# Altium project YOBA_Hamon_lite.PrjPcb
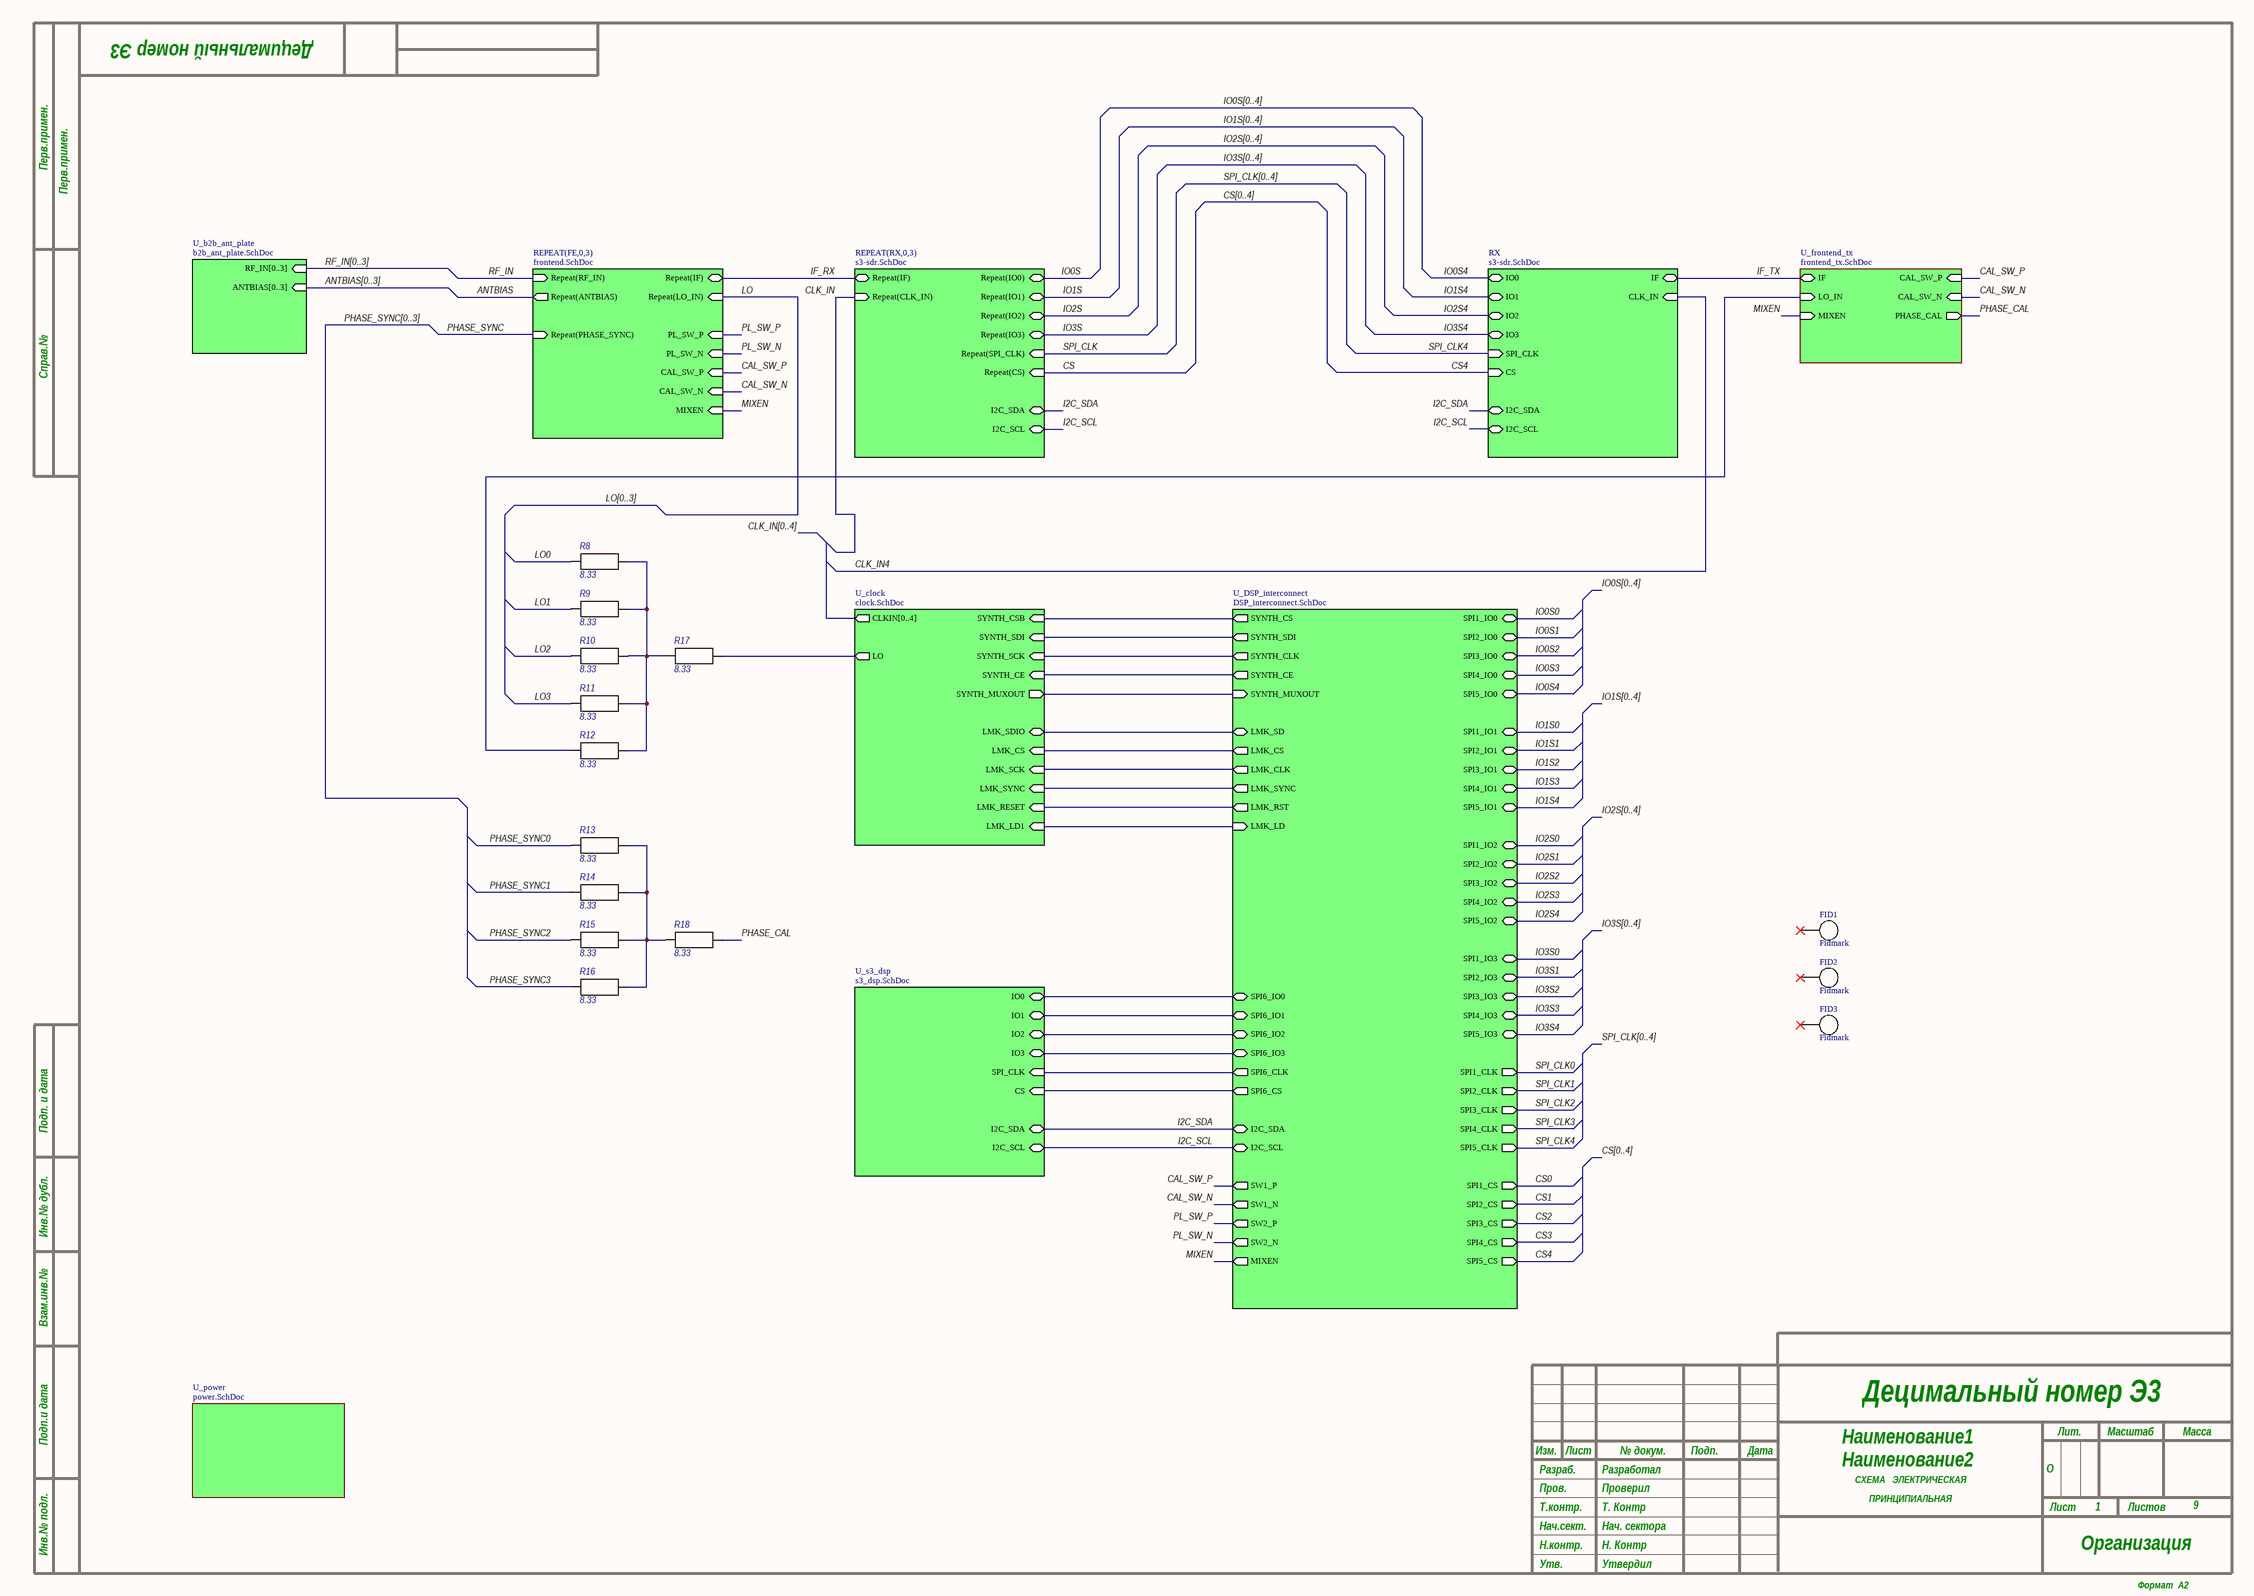
[diagram p0: main.SchDoc]
9 sheets, 333 parts. Net scope: hierarchical (ports join the sheet entries above them; power ports are global).
Board file: HamonLite_pcb.PcbDoc
Sheets:
  main.SchDoc
    FE0 = frontend.SchDoc
    FE1 = frontend.SchDoc
    FE2 = frontend.SchDoc
    FE3 = frontend.SchDoc
    RX0 = s3-sdr.SchDoc
    RX1 = s3-sdr.SchDoc
    RX2 = s3-sdr.SchDoc
    RX3 = s3-sdr.SchDoc
    U_b2b_ant_plate = b2b_ant_plate.SchDoc
    U_clock = clock.SchDoc
    RX = s3-sdr.SchDoc
    U_frontend_tx = frontend_tx.SchDoc
    U_power = power.SchDoc
    U_DSP_interconnect = DSP_interconnect.SchDoc
    U_s3_dsp = s3_dsp.SchDoc

## Sheet main.SchDoc: Наименование
size 594 x 420 mm; ApprovedBy: Утвердил; CheckedBy: Проверил; Author: Разработал; CompanyName: Организация; SheetNumber: 1; SheetTotal: 9; PageSetup: Record=PageOptions|CenterHorizontal=True|CenterVertical=True|PrintScale=0.94|XCorrection=1.00|YCorrection=1.00|PrintKind=1|BorderSize=5000000|LeftOffset=0|BottomOffset=0|Orientation=1|PaperLength=1000|PaperWidth=1000|Scale=100|PaperSource=7|PrintQuality=-4|MediaType=1|DitherType=10|PaperKind=A4|PrintScaleMode=1; DecimalNumber: Децимальный номер; HeadOfSector: Нач. сектора; MainDevice: Перв.примен.; Name1: Наименование1; lit_A: О; n_kontr: Н. Контр; t_kontr: Т. Контр; Name2: Наименование2; DocumentName: Sheet1.SCHDOC

### Parts
FID1  Fidmark  [FidMark]  (no BOM)
FID2  Fidmark  [FidMark]  (no BOM)
FID3  Fidmark  [FidMark]  (no BOM)
R8  8.33  [C0402R]
R9  8.33  [C0402R]
R10  8.33  [C0402R]
R11  8.33  [C0402R]
R12  8.33  [C0402R]
R13  8.33  [C0402R]
R14  8.33  [C0402R]
R15  8.33  [C0402R]
R16  8.33  [C0402R]
R17  8.33  [C0402R]
R18  8.33  [C0402R]

### Sub-sheets
REPEAT(FE,0,3) = frontend.SchDoc: Repeat(IF) (bidir), Repeat(LO_IN) (in), Repeat(RF_IN) (in), Repeat(PHASE_SYNC) (in), Repeat(ANTBIAS) (out), PL_SW_P (in), PL_SW_N (in), CAL_SW_P (in), CAL_SW_N (in), MIXEN (in)
REPEAT(RX,0,3) = s3-sdr.SchDoc: Repeat(IF) (bidir), Repeat(CLK_IN) (in), Repeat(IO0) (bidir), Repeat(IO1) (bidir), Repeat(IO2) (bidir), Repeat(IO3) (bidir), Repeat(SPI_CLK) (in), Repeat(CS) (in), I2C_SDA (bidir), I2C_SCL (bidir)
RX = s3-sdr.SchDoc: IF (bidir), CLK_IN (in), IO0 (bidir), IO1 (bidir), IO2 (bidir), IO3 (bidir), SPI_CLK (in), CS (in), I2C_SDA (bidir), I2C_SCL (bidir)
U_b2b_ant_plate = b2b_ant_plate.SchDoc: RF_IN[0..3] (in), ANTBIAS[0..3] (in)
U_clock = clock.SchDoc: SYNTH_CSB (in), SYNTH_SDI (in), SYNTH_SCK (in), SYNTH_CE (in), SYNTH_MUXOUT (out), LO (out), CLKIN[0..4] (out), LMK_SCK (in), LMK_SDIO (bidir), LMK_CS (in), LMK_SYNC (in), LMK_RESET (in), LMK_LD1 (in)
U_DSP_interconnect = DSP_interconnect.SchDoc: SPI1_CLK (out), SPI1_CS (out), SPI1_IO0 (bidir), SPI1_IO1 (bidir), SPI1_IO2 (bidir), SPI1_IO3 (bidir), SPI2_IO3 (bidir), SPI2_CS (out), SPI2_IO0 (bidir), SPI2_CLK (out), SPI2_IO1 (bidir), SPI2_IO2 (bidir), SPI3_IO3 (bidir), SPI3_CS (out), SPI3_IO0 (bidir), SPI3_IO1 (bidir), SPI3_IO2 (bidir), SPI3_CLK (out), SPI4_IO0 (bidir), SPI4_IO1 (bidir), SPI4_IO2 (bidir), SPI4_IO3 (bidir), SPI4_CS (out), SPI4_CLK (out), SPI5_IO0 (bidir), SPI5_IO3 (bidir), SPI5_CS (out), SPI5_CLK (out), SPI5_IO1 (bidir), SPI5_IO2 (bidir), SYNTH_CS (out), SYNTH_CLK (out), SYNTH_MUXOUT (in), SYNTH_SDI (out), SYNTH_CE (out), LMK_CLK (out), LMK_CS (out), LMK_SD (bidir), LMK_RST (out), LMK_SYNC (out), LMK_LD (in), I2C_SDA (bidir), I2C_SCL (bidir), SW1_N (out), SW1_P (out), SW2_P (out), SW2_N (out), MIXEN (out), SPI6_IO3 (bidir), SPI6_CS (out), SPI6_IO0 (bidir), SPI6_CLK (out), SPI6_IO1 (bidir), SPI6_IO2 (bidir)
U_frontend_tx = frontend_tx.SchDoc: LO_IN (in), IF (bidir), MIXEN (in), CAL_SW_N (in), CAL_SW_P (in), PHASE_CAL (out)
U_power = power.SchDoc: no entries
U_s3_dsp = s3_dsp.SchDoc: IO0 (bidir), IO1 (bidir), IO2 (bidir), IO3 (bidir), SPI_CLK (in), CS (in), I2C_SDA (bidir), I2C_SCL (bidir)

### Nets
ANTBIAS: sheet REPEAT(FE,0,3)/Repeat(ANTBIAS)
CAL_SW_N: sheet REPEAT(FE,0,3)/CAL_SW_N, sheet U_frontend_tx/CAL_SW_N, sheet U_DSP_interconnect/SW1_N
CAL_SW_P: sheet REPEAT(FE,0,3)/CAL_SW_P, sheet U_frontend_tx/CAL_SW_P, sheet U_DSP_interconnect/SW1_P
CLK: sheet U_DSP_interconnect/SPI6_CLK, sheet U_s3_dsp/SPI_CLK
CLK_IN: sheet REPEAT(RX,0,3)/Repeat(CLK_IN)
CS: sheet U_DSP_interconnect/SPI6_CS, sheet U_s3_dsp/CS
CS: sheet REPEAT(RX,0,3)/Repeat(CS)  [a separate net that carries the same name]
CS4: sheet RX/CS, sheet U_DSP_interconnect/SPI5_CS  [project net CS0]
I2C_SCL: sheet REPEAT(RX,0,3)/I2C_SCL, sheet RX/I2C_SCL, sheet U_DSP_interconnect/I2C_SCL, sheet U_s3_dsp/I2C_SCL
I2C_SDA: sheet REPEAT(RX,0,3)/I2C_SDA, sheet RX/I2C_SDA, sheet U_DSP_interconnect/I2C_SDA, sheet U_s3_dsp/I2C_SDA
IF_RX: sheet REPEAT(FE,0,3)/Repeat(IF), sheet REPEAT(RX,0,3)/Repeat(IF)
IF_TX: sheet RX/IF, sheet U_frontend_tx/IF  [project net IF]
IO0: sheet U_DSP_interconnect/SPI6_IO0, sheet U_s3_dsp/IO0
IO0S: sheet REPEAT(RX,0,3)/Repeat(IO0)
IO0S4: sheet RX/IO0, sheet U_DSP_interconnect/SPI5_IO0  [project net IO0]
IO1: sheet U_DSP_interconnect/SPI6_IO1, sheet U_s3_dsp/IO1
IO1S: sheet REPEAT(RX,0,3)/Repeat(IO1)
IO1S4: sheet RX/IO1, sheet U_DSP_interconnect/SPI5_IO1  [project net IO1]
IO2: sheet U_DSP_interconnect/SPI6_IO2, sheet U_s3_dsp/IO2
IO2S: sheet REPEAT(RX,0,3)/Repeat(IO2)
IO2S4: sheet RX/IO2, sheet U_DSP_interconnect/SPI5_IO2  [project net IO2]
IO3: sheet U_DSP_interconnect/SPI6_IO3, sheet U_s3_dsp/IO3
IO3S: sheet REPEAT(RX,0,3)/Repeat(IO3)
IO3S4: sheet RX/IO3, sheet U_DSP_interconnect/SPI5_IO3  [project net IO3]
LMK_CLK: sheet U_clock/LMK_SCK, sheet U_DSP_interconnect/LMK_CLK
LMK_CS: sheet U_clock/LMK_CS, sheet U_DSP_interconnect/LMK_CS
LMK_LD: sheet U_clock/LMK_LD1, sheet U_DSP_interconnect/LMK_LD
LMK_RESET: sheet U_clock/LMK_RESET, sheet U_DSP_interconnect/LMK_RST
LMK_SD: sheet U_clock/LMK_SDIO, sheet U_DSP_interconnect/LMK_SD
LMK_SYNC: sheet U_clock/LMK_SYNC, sheet U_DSP_interconnect/LMK_SYNC
LO: sheet REPEAT(FE,0,3)/Repeat(LO_IN)
LO0: R8.2
LO1: R9.2
LO2: R10.2
LO3: R11.2
MIXEN: sheet REPEAT(FE,0,3)/MIXEN, sheet U_frontend_tx/MIXEN, sheet U_DSP_interconnect/MIXEN
PHASE_CAL: R18.1 ; sheet U_frontend_tx/PHASE_CAL
PHASE_SYNC: sheet REPEAT(FE,0,3)/Repeat(PHASE_SYNC)
PHASE_SYNC0: R13.2
PHASE_SYNC1: R14.2
PHASE_SYNC2: R15.2
PHASE_SYNC3: R16.2
PL_SW_N: sheet REPEAT(FE,0,3)/PL_SW_N, sheet U_DSP_interconnect/SW2_N
PL_SW_P: sheet REPEAT(FE,0,3)/PL_SW_P, sheet U_DSP_interconnect/SW2_P
RF_IN: sheet REPEAT(FE,0,3)/Repeat(RF_IN)
SPI_CLK: sheet REPEAT(RX,0,3)/Repeat(SPI_CLK)
SPI_CLK4: sheet RX/SPI_CLK, sheet U_DSP_interconnect/SPI5_CLK  [project net CLK]
SYNTH_CE: sheet U_clock/SYNTH_CE, sheet U_DSP_interconnect/SYNTH_CE
SYNTH_CLK: sheet U_clock/SYNTH_SCK, sheet U_DSP_interconnect/SYNTH_CLK
SYNTH_CS: sheet U_clock/SYNTH_CSB, sheet U_DSP_interconnect/SYNTH_CS
SYNTH_MOSI: sheet U_clock/SYNTH_SDI, sheet U_DSP_interconnect/SYNTH_SDI
SYNTH_MUXOUT: sheet U_clock/SYNTH_MUXOUT, sheet U_DSP_interconnect/SYNTH_MUXOUT
NetC66_2: R17.1 ; sheet U_clock/LO
NetC73_1: R12.2 ; sheet U_frontend_tx/LO_IN
NetR8_1: R8.1 R9.1 R10.1 R11.1 R12.1 R17.2
NetR13_1: R13.1 R14.1 R15.1 R16.1 R18.2

Not connected (* = marked no-connect by the designer): FID1 1*; FID2 1*; FID3 1*

### Buses and harness runs
bus ANTBIAS[0..3] = sheet U_b2b_ant_plate/ANTBIAS[0..3]
bus CLK_IN[0..4] = sheet U_clock/CLKIN[0..4]
bus CS[0..4]
bus IO0S[0..4]
bus IO1S[0..4]
bus IO2S[0..4]
bus IO3S[0..4]
bus LO[0..3]
bus PHASE_SYNC[0..3]
bus RF_IN[0..3] = sheet U_b2b_ant_plate/RF_IN[0..3]
bus SPI_CLK[0..4]

### Notes on the sheet
- Перв.примен.
- Справ.№
- Подп. и дата
- Инв.№ дубл.
- Взам.инв.№
- Подп.и дата
- Разраб.
- Изм.
- Лист
- № докум.
- Подп.
- Дата
- Лит.
- Масштаб
- Масса
- Т.контр.
- Пров.
- СХЕМА   ЭЛЕКТРИЧЕСКАЯ
- ПРИНЦИПИАЛЬНАЯ
- Листов
- Инв.№ подл.
- Утв.
- Н.контр.
- Нач.сект.
- Формат  A2

### Library data of the parts
R8-R18 = res: Value: 8.33

## Sheet frontend.SchDoc: Наименование
size 420 x 297 mm; ApprovedBy: Утвердил; CheckedBy: Проверил; Author: Разработал; CompanyName: ВлГУ; DrawnBy: Н.Контр; Engineer: Т.Контр; SheetNumber: 3; SheetTotal: 9; PageSetup: Record=PageOptions|CenterHorizontal=True|CenterVertical=True|PrintScale=0.94|XCorrection=1.00|YCorrection=1.00|PrintKind=1|BorderSize=5000000|LeftOffset=0|BottomOffset=0|Orientation=1|PaperLength=1000|PaperWidth=1000|Scale=100|PaperSource=7|PrintQuality=-4|MediaType=1|DitherType=10|PaperKind=A4|PrintScaleMode=1; DecimalNumber: Децимальный номер; HeadOfSector: Нач. сектора; MainDevice: Перв.примен.; Name: Наименование; DocumentName: Sheet1.SCHDOC
Used 4 times, as channels FE0, FE1, FE2, FE3. Parts and nets are listed once, with the designators drawn on the sheet.
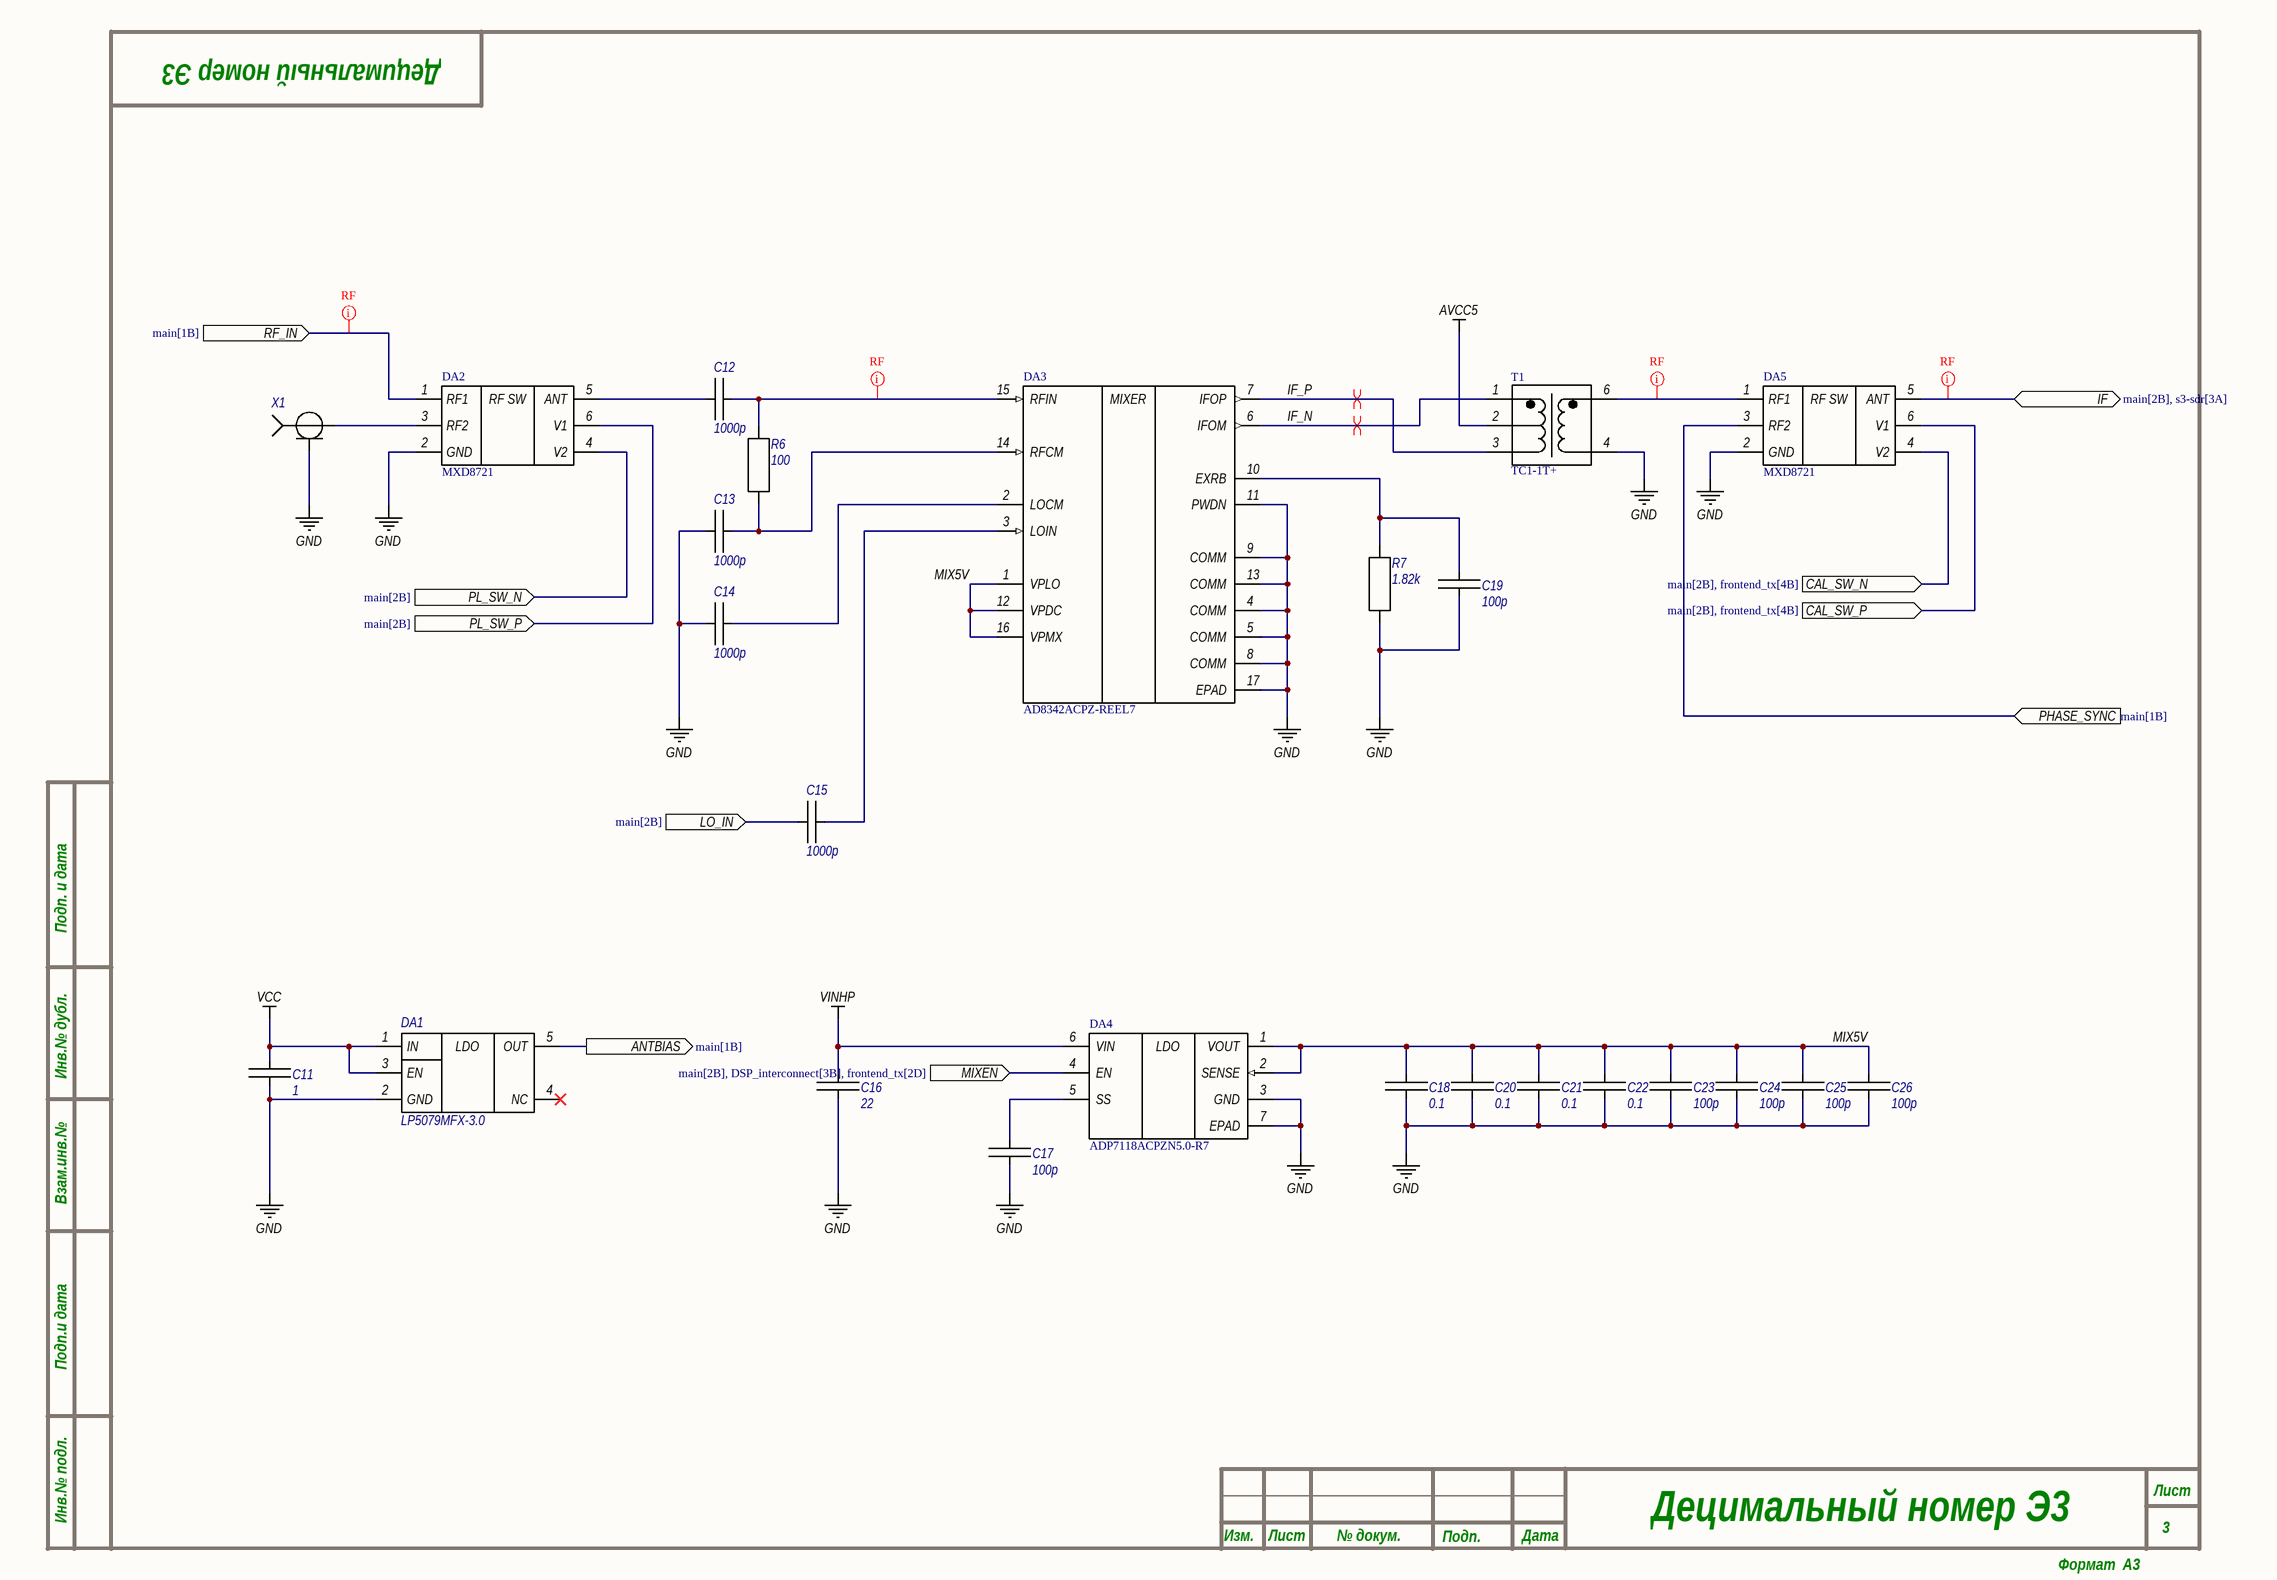
[diagram p1: frontend.SchDoc]

### Parts
C11  1  [C0805C]
C12  1000p  [C0402C]
C13  1000p  [C0402C]
C14  1000p  [C0402C]
C15  1000p  [C0402C]
C16  22  [C0805C]
C17  100p  [C0603C]
C18  0.1  [C0805C]
C19  100p  [C0603C]
C20  0.1  [C0805C]
C21  0.1  [C0805C]
C22  0.1  [C0805C]
C23  100p  [C0603C]
C24  100p  [C0603C]
C25  100p  [C0603C]
C26  100p  [C0603C]
DA1  LP5079MFX-3.0  [SOT23-5]
DA2  MXD8721  [SON35P100X50-6N]
DA3  AD8342ACPZ-REEL7  [CP_16_27_ADI-M]
DA4  ADP7118ACPZN5.0-R7  [CP-6-3_ADI]
DA5  MXD8721  [SON35P100X50-6N]
R6  100  [C0603R]
R7  1.82k  [C0603R]
T1  TC1-1T+  [AT224-1A_MNC]
X1  (no value)  [IPEX PAD]

### Ports
ANTBIAS (out, see main[1B]), CAL_SW_N (in, see main[2B], frontend_tx[4B]), CAL_SW_P (in, see main[2B], frontend_tx[4B]), IF (bidir, see main[2B], s3-sdr[3A]), LO_IN (in, see main[2B]), MIXEN (in, see main[2B], DSP_interconnect[3B], frontend_tx[2D]), PHASE_SYNC (in, see main[1B]), PL_SW_N (in, see main[2B]), PL_SW_P (in, see main[2B]), RF_IN (in, see main[1B])

### Nets
AVCC5: T1.2(SCONDARY_CT)
GND: C11.2 C13.1 C14.1 C16.2 C17.2 C18.2 C19.2 C20.2 C21.2 C22.2 C23.2 C24.2 C25.2 C26.2 DA1.2(GND) DA2.2(GND) DA3.4(COMM) DA3.5(COMM) DA3.8(COMM) DA3.9(COMM) DA3.11(PWDN) DA3.13(COMM) DA3.17(EPAD) DA4.3(GND) DA4.7(EPAD) DA5.2(GND) R7.2 T1.4(PRIMARY) X1.2
VCC: C11.1 DA1.1(IN) DA1.3(EN)
VINHP: C16.1 DA4.6(VIN)
ANTBIAS: DA1.5(OUT) ; port ANTBIAS
CAL_SW_N: DA5.4(V2) ; port CAL_SW_N
CAL_SW_P: DA5.6(V1) ; port CAL_SW_P
IF: DA5.5(ANT) ; port IF
IF_N: DA3.6(IFOM) T1.1(SECONDARY_DOT)  [project net IF_N_3]
IF_P: DA3.7(IFOP) T1.3(SECONDARY)  [project net IF_P_3]
LO_IN: C15.1 ; port LO_IN
MIX5V: C18.1 C20.1 C21.1 C22.1 C23.1 C24.1 C25.1 C26.1 DA3.1(VPLO) DA3.12(VPDC) DA3.16(VPMX) DA4.1(VOUT) DA4.2(SENSE)  [project net MIX5V_3]
MIXEN: DA4.4(EN) ; port MIXEN
PHASE_SYNC: DA5.3(RF2) ; port PHASE_SYNC
PL_SW_N: DA2.4(V2) ; port PL_SW_N
PL_SW_P: DA2.6(V1) ; port PL_SW_P
RF_IN: DA2.1(RF1) ; port RF_IN
NetC12_1: C12.1 DA2.5(ANT)
NetC12_2: C12.2 DA3.15(RFIN) R6.1
NetC13_2: C13.2 DA3.14(RFCM) R6.2
NetC14_2: C14.2 DA3.2(LOCM)
NetC15_2: C15.2 DA3.3(LOIN)
NetC17_1: C17.1 DA4.5(SS)
NetC19_1: C19.1 DA3.10(EXRB) R7.1
NetDA2_3: DA2.3(RF2) X1.1
NetDA5_1: DA5.1(RF1) T1.6(PRIMARY_DOT)

Not connected (* = marked no-connect by the designer): DA1 4(NC)*

### Channels
FE0: designators end in A; ports ANTBIAS=ANTBIAS0 CAL_SW_N=CAL_SW_N CAL_SW_P=CAL_SW_P IF=IF LO_IN=LO0 MIXEN=MIXEN PHASE_SYNC=PHASE_SYNC0 PL_SW_N=PL_SW_N PL_SW_P=PL_SW_P RF_IN=RF_IN0
FE1: designators end in B; ports ANTBIAS=ANTBIAS1 CAL_SW_N=CAL_SW_N CAL_SW_P=CAL_SW_P IF=IF LO_IN=LO1 MIXEN=MIXEN PHASE_SYNC=PHASE_SYNC1 PL_SW_N=PL_SW_N PL_SW_P=PL_SW_P RF_IN=RF_IN1
FE2: designators end in C; ports ANTBIAS=ANTBIAS2 CAL_SW_N=CAL_SW_N CAL_SW_P=CAL_SW_P IF=IF LO_IN=LO2 MIXEN=MIXEN PHASE_SYNC=PHASE_SYNC2 PL_SW_N=PL_SW_N PL_SW_P=PL_SW_P RF_IN=RF_IN2
FE3: designators end in D; ports ANTBIAS=ANTBIAS3 CAL_SW_N=CAL_SW_N CAL_SW_P=CAL_SW_P IF=IF LO_IN=LO3 MIXEN=MIXEN PHASE_SYNC=PHASE_SYNC3 PL_SW_N=PL_SW_N PL_SW_P=PL_SW_P RF_IN=RF_IN3

### Layout directives
net class RF: IF, NetC12A_2, NetDA5A_1, RF_IN0
differential pair: IF_N_FE0, IF_P_FE0

### Notes on the sheet
- Подп. и дата
- Инв.№ дубл.
- Взам.инв.№
- Подп.и дата
- Инв.№ подл.
- Изм.
- Лист
- № докум.
- Подп.
- Дата
- Формат  A3
- (in symbol AD8342ACPZ-REEL7) MIXER
- (in symbol ADP7118ACPZN5.0-R7) LDO
- (in symbol LP5907) LDO
- (in symbol MXD8721) RF SW

### Library data of the parts
C11-C26 = Cap
  C11: Value: 1
  C12-C15: Value: 1000p
  C16: Value: 22
  C17 C19 C23-C26: Value: 100p
  C18 C20-C22: Value: 0.1
DA1 = LP5907: Part number: LP5079MFX-3.0
DA2 DA5 = MXD8721: 0.5-6.0GHz SPDT Switch; Part number: MXD8721
DA3 = AD8342ACPZ-REEL7: Active Receive Mixer LF to 3 GHz; Manufacturer_Name: Analog Devices Inc; Copyright: Copyright (C) 2025 Ultra Librarian. All rights reserved.; Manufacturer_Part_Number: AD8342ACPZ-REEL7; RefDes: RefDes; Type: Type
DA4 = ADP7118ACPZN5.0-R7: 20 V, 200 mA, Low Noise, CMOS LDO Linear Regulator; Manufacturer_Name: Analog Devices Inc; Copyright: Copyright (C) 2026 Ultra Librarian. All rights reserved.; Manufacturer_Part_Number: ADP7118ACPZN5.0-R7; Datasheet: https://www.analog.com/media/en/technical-documentation/data-sheets/adp7118.pdf; RefDes: RefDes; Type: Type
R6 R7 = res
  R6: Value: 100
  R7: Value: 1.82k
T1 = TC1-1T+: Description; Manufacturer_Name: Mini Circuits; Type: Balun; Copyright: Copyright (C) 2026 Ultra Librarian. All rights reserved.; Manufacturer_Part_Number: TC1-1T+; RefDes: RefDes
X1 = Ipex

## Sheet s3-sdr.SchDoc
size 420 x 297 mm; SheetNumber: 2; SheetTotal: 9
Used 5 times, as channels RX0, RX1, RX2, RX3, RX. Parts and nets are listed once, with the designators drawn on the sheet.
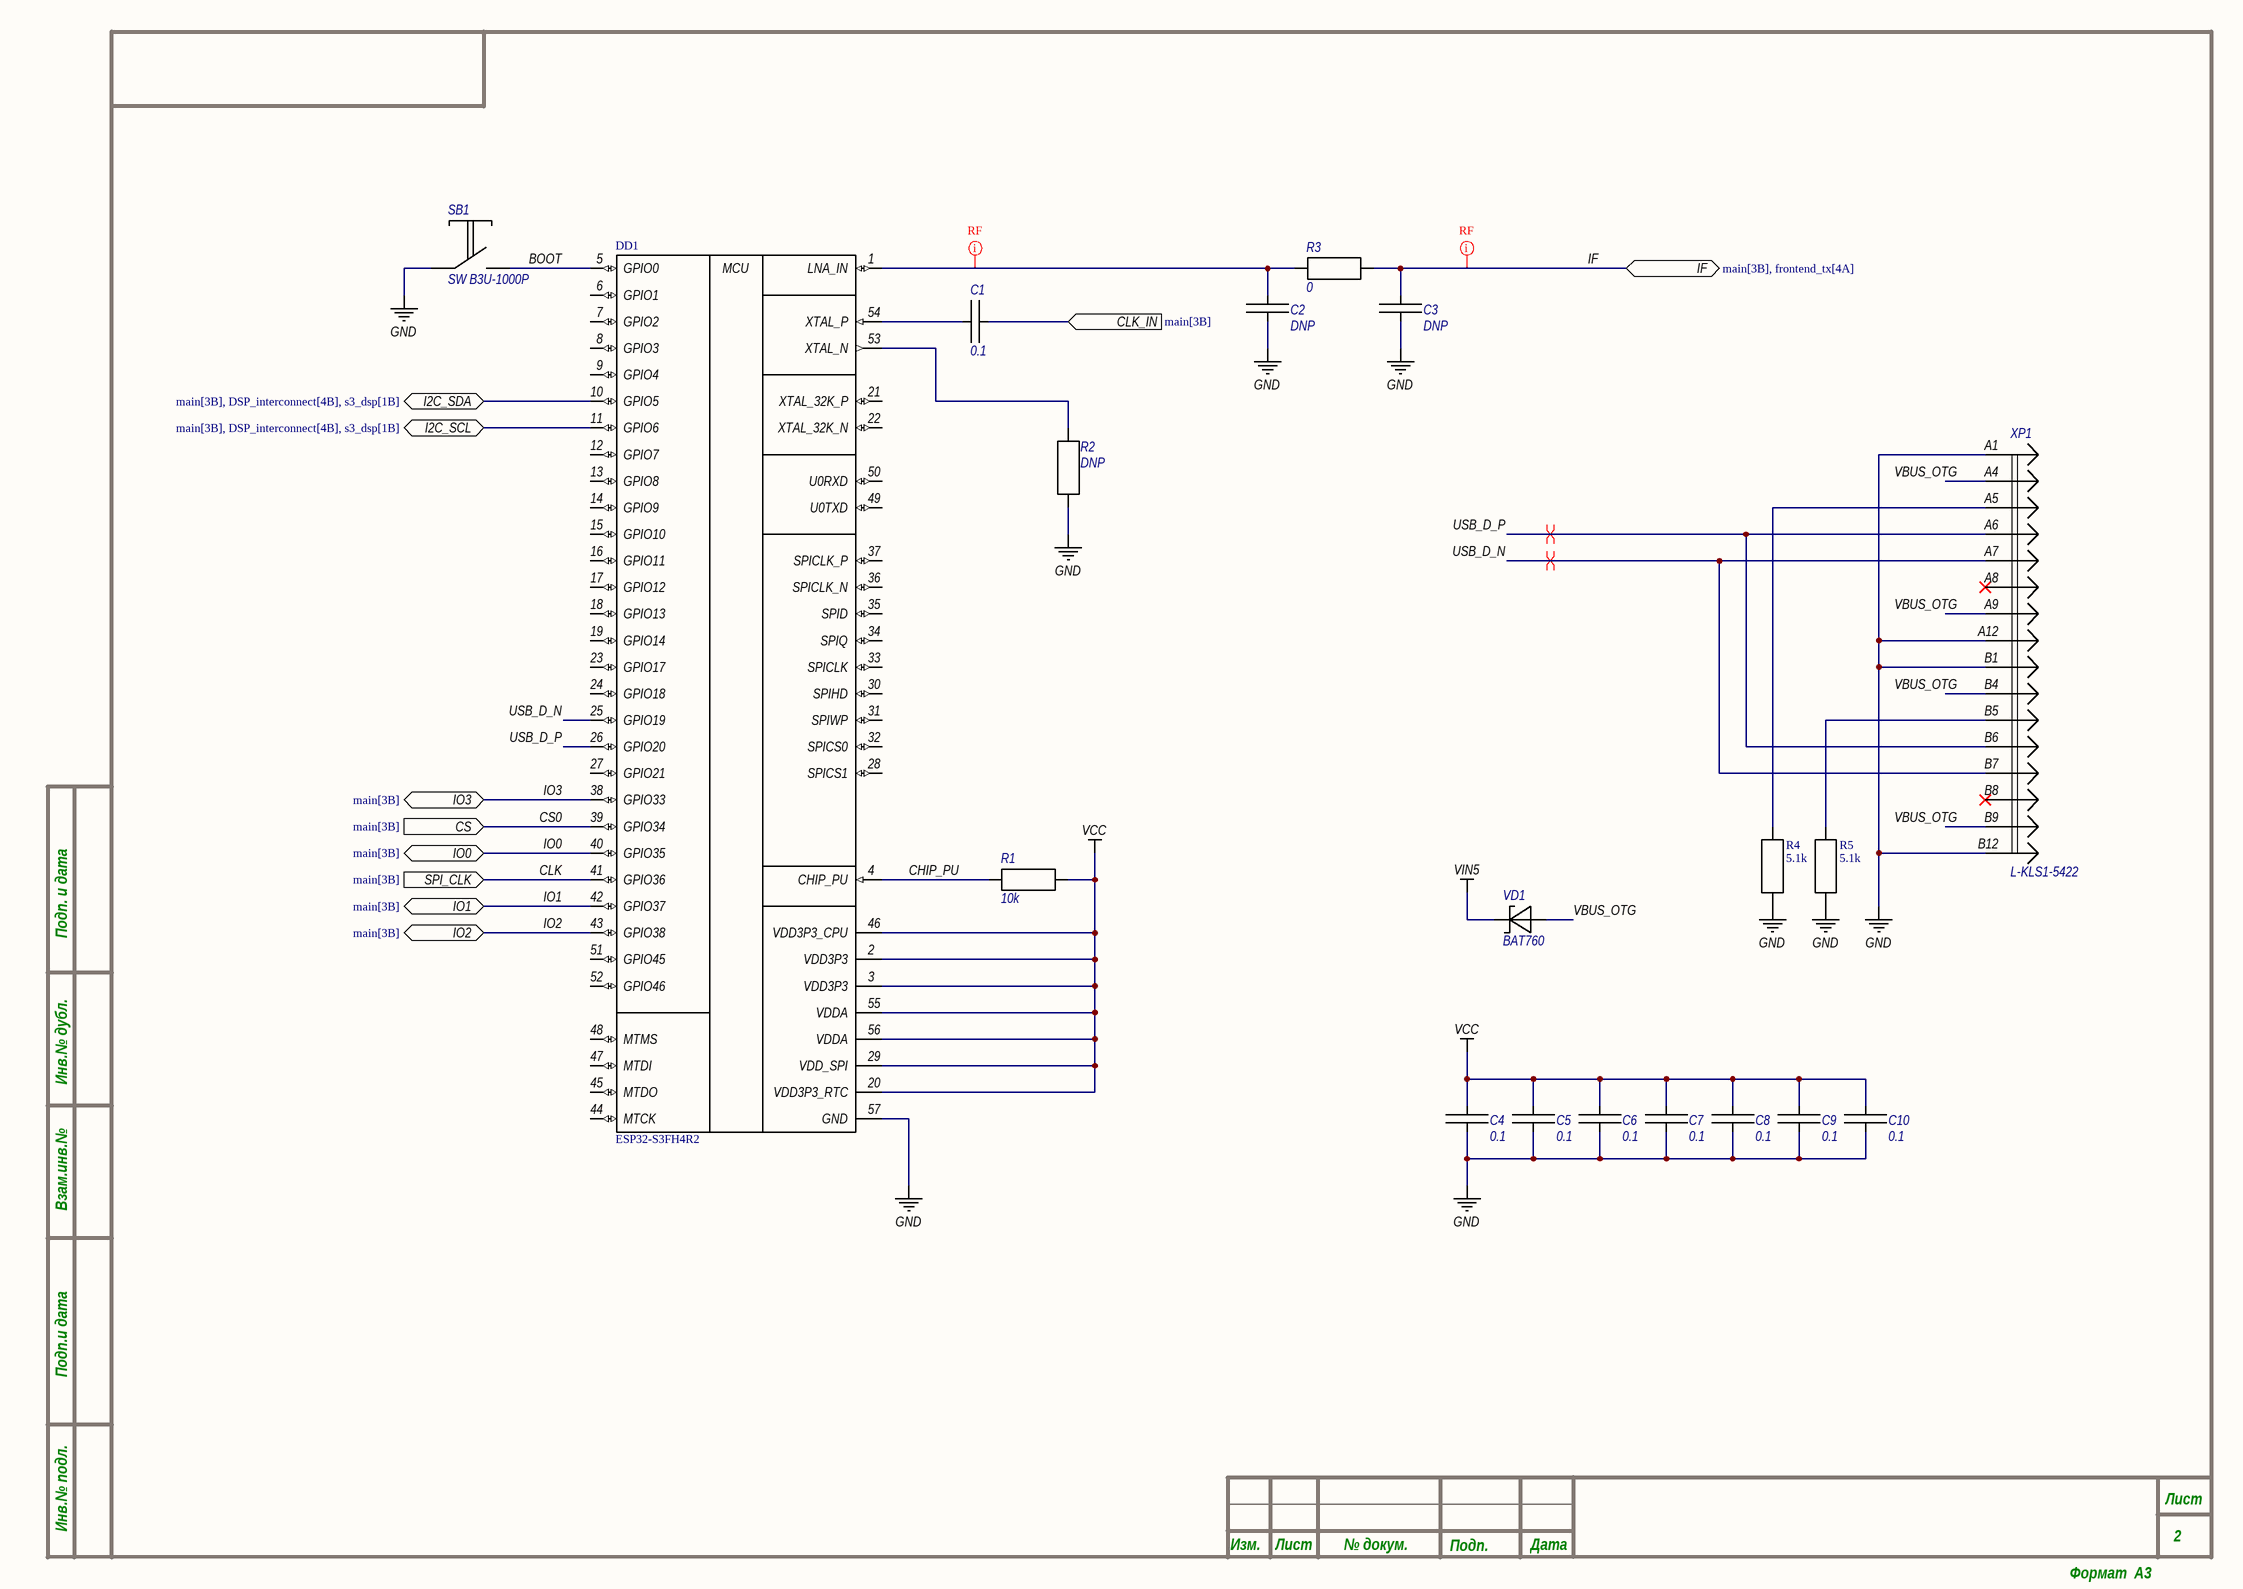
[diagram p2: s3-sdr.SchDoc]

### Parts
C1  0.1  [C0805C]
C2  DNP  [C0402C]
C3  DNP  [C0402C]
C4  0.1  [C0805C]
C5  0.1  [C0805C]
C6  0.1  [C0805C]
C7  0.1  [C0805C]
C8  0.1  [C0805C]
C9  0.1  [C0805C]
C10  0.1  [C0805C]
DD1  ESP32-S3FH4R2  [QFN56_7X7_EXP-M]
R1  10k  [C0805R]
R2  DNP  [C0603R]
R3  0  [C0402R]
R4  5.1k  [C0805R]
R5  5.1k  [C0805R]
SB1  SW B3U-1000P  [SW_B3U-1000P]
VD1  BAT760  [SOD123]
XP1  L-KLS1-5422  [L-KLS1-5422]

### Ports
CLK_IN (in, see main[3B]), CS (in, see main[3B]), I2C_SCL (bidir, see main[3B], DSP_interconnect[4B], s3_dsp[1B]), I2C_SDA (bidir, see main[3B], DSP_interconnect[4B], s3_dsp[1B]), IF (bidir, see main[3B], frontend_tx[4A]), IO0 (bidir, see main[3B]), IO1 (bidir, see main[3B]), IO2 (bidir, see main[3B]), IO3 (bidir, see main[3B]), SPI_CLK (in, see main[3B])

### Nets
GND: C2.1 C3.1 C4.2 C5.2 C6.2 C7.2 C8.2 C9.2 C10.2 DD1.57(GND) R2.2 R4.2 R5.2 SB1.1 XP1.A1 XP1.A12 XP1.B1 XP1.B12
VCC: C4.1 C5.1 C6.1 C7.1 C8.1 C9.1 C10.1 DD1.2(VDD3P3) DD1.3(VDD3P3) DD1.20(VDD3P3_RTC) DD1.29(VDD_SPI) DD1.46(VDD3P3_CPU) DD1.55(VDDA) DD1.56(VDDA) R1.1
VIN5: VD1.C
BOOT: DD1.5(GPIO0) SB1.2  [project net BOOT_2]
CHIP_PU: DD1.4(CHIP_PU) R1.2  [project net CHIP_PU_2]
CLK: DD1.41(GPIO36) ; port SPI_CLK
CLK_IN: C1.2 ; port CLK_IN
CS0: DD1.39(GPIO34) ; port CS
I2C_SCL: DD1.11(GPIO6) ; port I2C_SCL
I2C_SDA: DD1.10(GPIO5) ; port I2C_SDA
IF: C3.2 R3.1 ; port IF
IO0: DD1.40(GPIO35) ; port IO0
IO1: DD1.42(GPIO37) ; port IO1
IO2: DD1.43(GPIO38) ; port IO2
IO3: DD1.38(GPIO33) ; port IO3
USB_D_N: DD1.25(GPIO19) XP1.A7 XP1.B7  [project net USB_D_N_2]
USB_D_P: DD1.26(GPIO20) XP1.A6 XP1.B6  [project net USB_D_P_2]
VBUS_OTG: VD1.A XP1.A4 XP1.A9 XP1.B4 XP1.B9  [project net VBUS_OTG_2]
NetC1_1: C1.1 DD1.54(XTAL_P)
NetC2_2: C2.2 DD1.1(LNA_IN) R3.2
NetDD1_53: DD1.53(XTAL_N) R2.1
NetR4_1: R4.1 XP1.A5
NetR5_1: R5.1 XP1.B5

Not connected (* = marked no-connect by the designer): DD1 6(GPIO1) 7(GPIO2) 8(GPIO3) 9(GPIO4) 12(GPIO7) 13(GPIO8) 14(GPIO9) 15(GPIO10) 16(GPIO11) 17(GPIO12) 18(GPIO13) 19(GPIO14) 21(XTAL_32K_P) 22(XTAL_32K_N) 23(GPIO17) 24(GPIO18) 27(GPIO21) 28(SPICS1) 30(SPIHD) 31(SPIWP) 32(SPICS0) 33(SPICLK) 34(SPIQ) 35(SPID) 36(SPICLK_N) 37(SPICLK_P) 44(MTCK) 45(MTDO) 47(MTDI) 48(MTMS) 49(U0TXD) 50(U0RXD) 51(GPIO45) 52(GPIO46); XP1 A8* B8*

### Channels
RX0: designators end in B; ports CLK_IN=CLK_IN0 CS=CS0 I2C_SCL=I2C_SCL I2C_SDA=I2C_SDA IF=IF IO0=IO0 IO1=IO1 IO2=IO2 IO3=IO3 SPI_CLK=CLK
RX1: designators end in C; ports CLK_IN=CLK_IN1 CS=CS0 I2C_SCL=I2C_SCL I2C_SDA=I2C_SDA IF=IF IO0=IO0 IO1=IO1 IO2=IO2 IO3=IO3 SPI_CLK=CLK
RX2: designators end in D; ports CLK_IN=CLK_IN2 CS=CS0 I2C_SCL=I2C_SCL I2C_SDA=I2C_SDA IF=IF IO0=IO0 IO1=IO1 IO2=IO2 IO3=IO3 SPI_CLK=CLK
RX3: designators end in E; ports CLK_IN=CLK_IN3 CS=CS0 I2C_SCL=I2C_SCL I2C_SDA=I2C_SDA IF=IF IO0=IO0 IO1=IO1 IO2=IO2 IO3=IO3 SPI_CLK=CLK
RX: designators end in A; ports CLK_IN=CLK_IN4 CS=CS0 I2C_SCL=I2C_SCL I2C_SDA=I2C_SDA IF=IF IO0=IO0 IO1=IO1 IO2=IO2 IO3=IO3 SPI_CLK=CLK

### Layout directives
net class RF: IF, NetC2B_2
differential pair: USB_D_N_RX0, USB_D_P_RX0

### Notes on the sheet
- Подп. и дата
- Инв.№ дубл.
- Взам.инв.№
- Подп.и дата
- Инв.№ подл.
- Изм.
- Лист
- № докум.
- Подп.
- Дата
- Формат  A3
- (in symbol ESP32-S3) MCU

### Library data of the parts
C1-C10 = Cap
  C1 C4-C10: Value: 0.1
  C2 C3: Value: DNP
DD1 = ESP32-S3: Description; Manufacturer_Name: Espressif Systems; Copyright: Copyright (C) 2025 Ultra Librarian. All rights reserved.; Manufacturer_Part_Number: ESP32-S3; RefDes: RefDes; Type: Type
R1-R3 = res
  R1: Value: 10k
  R2: Value: DNP
  R3: Value: 0
R4 R5 = res: MAPPING: 2(1,2,100)(1,2,100); Value: 5.1k; TYPE: Resistor
SB1 = SW-PB: Part number: SW B3U-1000P
VD1 = Shotktky Diode: Part number: BAT760
XP1 = L-KLS1-5422: Стандарт USB 3.1 , Тип стандарта Type C , Монтаж На плату, SMD , Тип разъема Розетка , Количество портов 1 , Расположение контактов Прямое; Part number: L-KLS1-5422

## Sheet b2b_ant_plate.SchDoc: Наименование
size 594 x 420 mm; ApprovedBy: Утвердил; CheckedBy: Проверил; Author: Разработал; CompanyName: ВлГУ; DrawnBy: Н.Контр; Engineer: Т.Контр; SheetNumber: 6; SheetTotal: 9; PageSetup: Record=PageOptions|CenterHorizontal=True|CenterVertical=True|PrintScale=0.94|XCorrection=1.00|YCorrection=1.00|PrintKind=1|BorderSize=5000000|LeftOffset=0|BottomOffset=0|Orientation=1|PaperLength=1000|PaperWidth=1000|Scale=100|PaperSource=7|PrintQuality=-4|MediaType=1|DitherType=10|PaperKind=A4|PrintScaleMode=1; DecimalNumber: Децимальный номер; HeadOfSector: Нач. сектора; MainDevice: Перв.примен.; Name: Наименование; DocumentName: Sheet1.SCHDOC
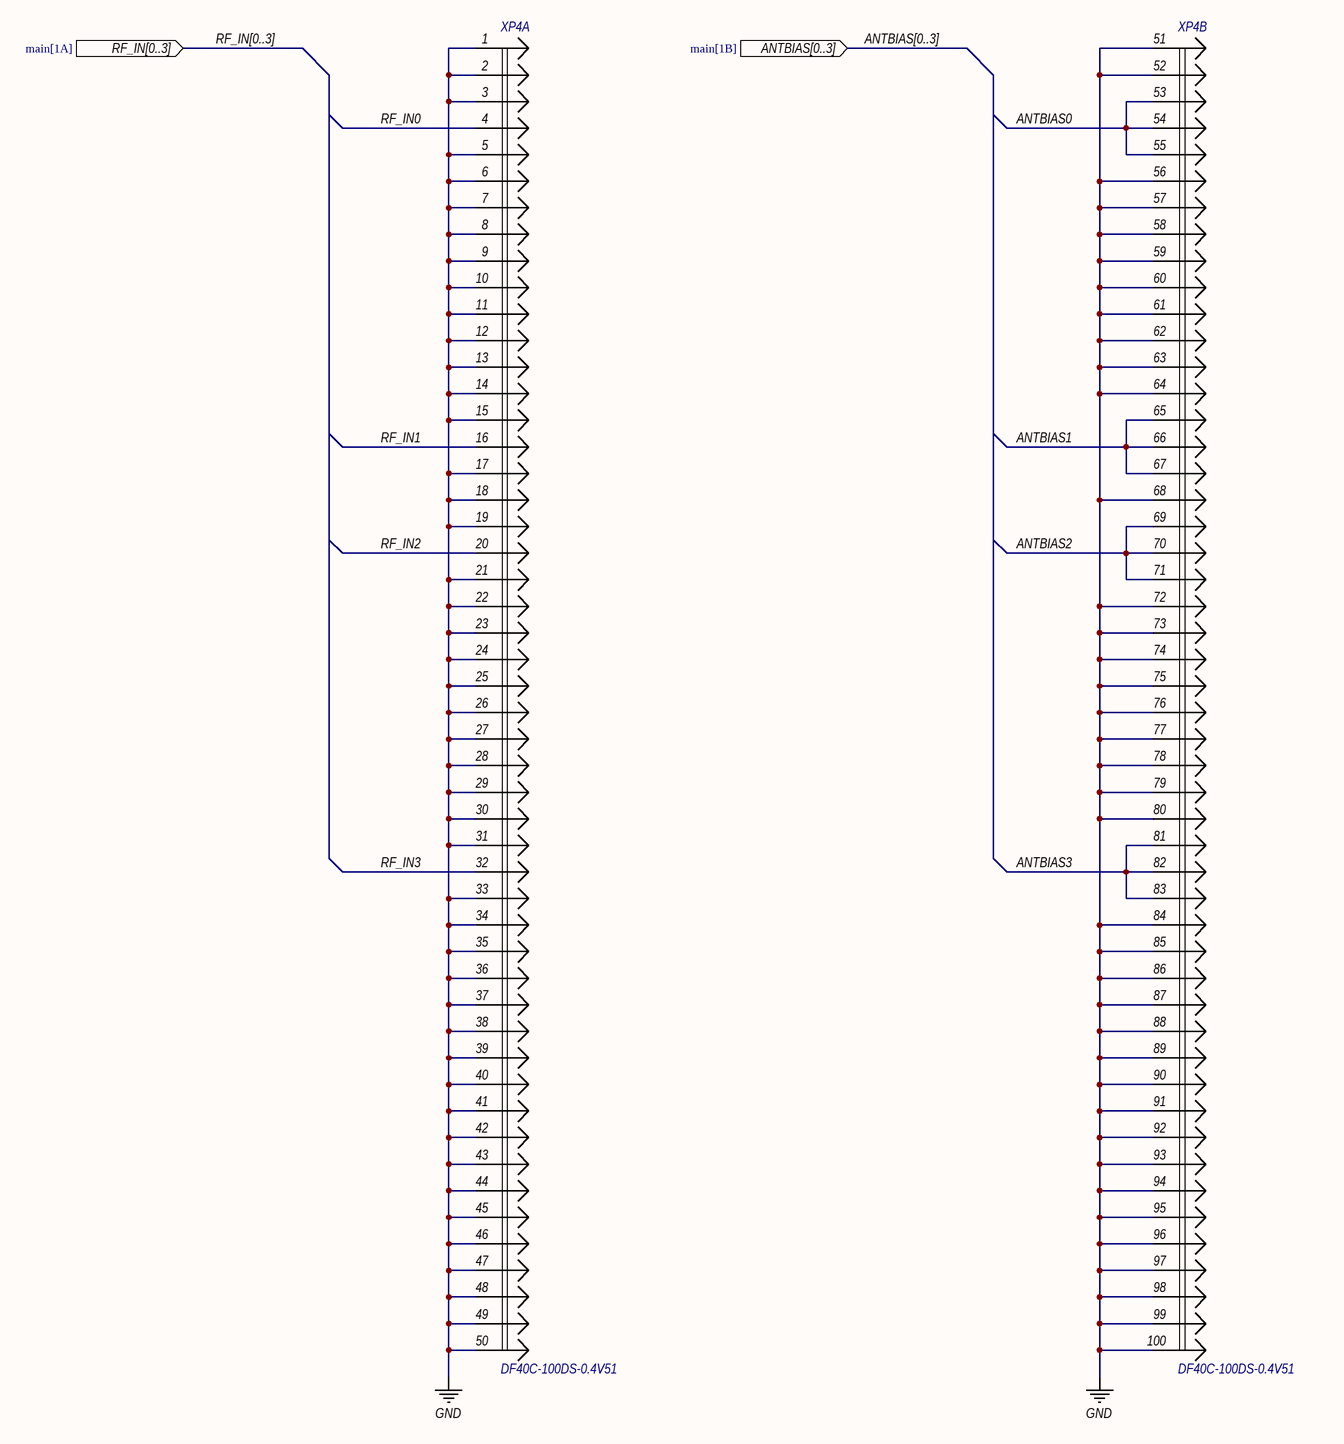
[diagram p3: b2b_ant_plate.SchDoc]

### Parts
XP4  DF40C-100DS-0.4V51  [CONN_DF40C-100DS-0.4V51_HIR]  (parts A,B of 2)

### Ports
ANTBIAS[0..3] (in, see main[1B]), RF_IN[0..3] (in, see main[1A])

### Nets
GND: XP4.1 XP4.2 XP4.3 XP4.5 XP4.6 XP4.7 XP4.8 XP4.9 XP4.10 XP4.11 XP4.12 XP4.13 XP4.14 XP4.15 XP4.17 XP4.18 XP4.19 XP4.21 XP4.22 XP4.23 XP4.24 XP4.25 XP4.26 XP4.27 XP4.28 XP4.29 XP4.30 XP4.31 XP4.33 XP4.34 XP4.35 XP4.36 XP4.37 XP4.38 XP4.39 XP4.40 XP4.41 XP4.42 XP4.43 XP4.44 XP4.45 XP4.46 XP4.47 XP4.48 XP4.49 XP4.50 XP4.51 XP4.52 XP4.56 XP4.57 XP4.58 XP4.59 XP4.60 XP4.61 XP4.62 XP4.63 XP4.64 XP4.68 XP4.72 XP4.73 XP4.74 XP4.75 XP4.76 XP4.77 XP4.78 XP4.79 XP4.80 XP4.84 XP4.85 XP4.86 XP4.87 XP4.88 XP4.89 XP4.90 XP4.91 XP4.92 XP4.93 XP4.94 XP4.95 XP4.96 XP4.97 XP4.98 XP4.99 XP4.100
ANTBIAS0: XP4.53 XP4.54 XP4.55
ANTBIAS1: XP4.65 XP4.66 XP4.67
ANTBIAS2: XP4.69 XP4.70 XP4.71
ANTBIAS3: XP4.81 XP4.82 XP4.83
RF_IN0: XP4.4
RF_IN1: XP4.16
RF_IN2: XP4.20
RF_IN3: XP4.32

### Buses and harness runs
bus ANTBIAS[0..3] = port ANTBIAS[0..3]
bus RF_IN[0..3] = port RF_IN[0..3]

### Notes on the sheet
- Подп. и дата
- Инв.№ дубл.
- Взам.инв.№
- Подп.и дата
- Инв.№ подл.
- Изм.
- Лист
- № докум.
- Подп.
- Дата
- Формат  A2

### Library data of the parts
XP4 = DF40C-100DS-0.4V51: DF40C 100 pin socket; Part number: DF40C-100DS-0.4V51

## Sheet clock.SchDoc: Наименование
size 594 x 420 mm; ApprovedBy: Утвердил; CheckedBy: Проверил; Author: Разработал; CompanyName: ВлГУ; DrawnBy: Н.Контр; Engineer: Т.Контр; SheetNumber: 5; SheetTotal: 9; PageSetup: Record=PageOptions|CenterHorizontal=True|CenterVertical=True|PrintScale=0.94|XCorrection=1.00|YCorrection=1.00|PrintKind=1|BorderSize=5000000|LeftOffset=0|BottomOffset=0|Orientation=1|PaperLength=1000|PaperWidth=1000|Scale=100|PaperSource=7|PrintQuality=-4|MediaType=1|DitherType=10|PaperKind=A4|PrintScaleMode=1; DecimalNumber: Децимальный номер; HeadOfSector: Нач. сектора; MainDevice: Перв.примен.; Name: Наименование; DocumentName: Sheet1.SCHDOC
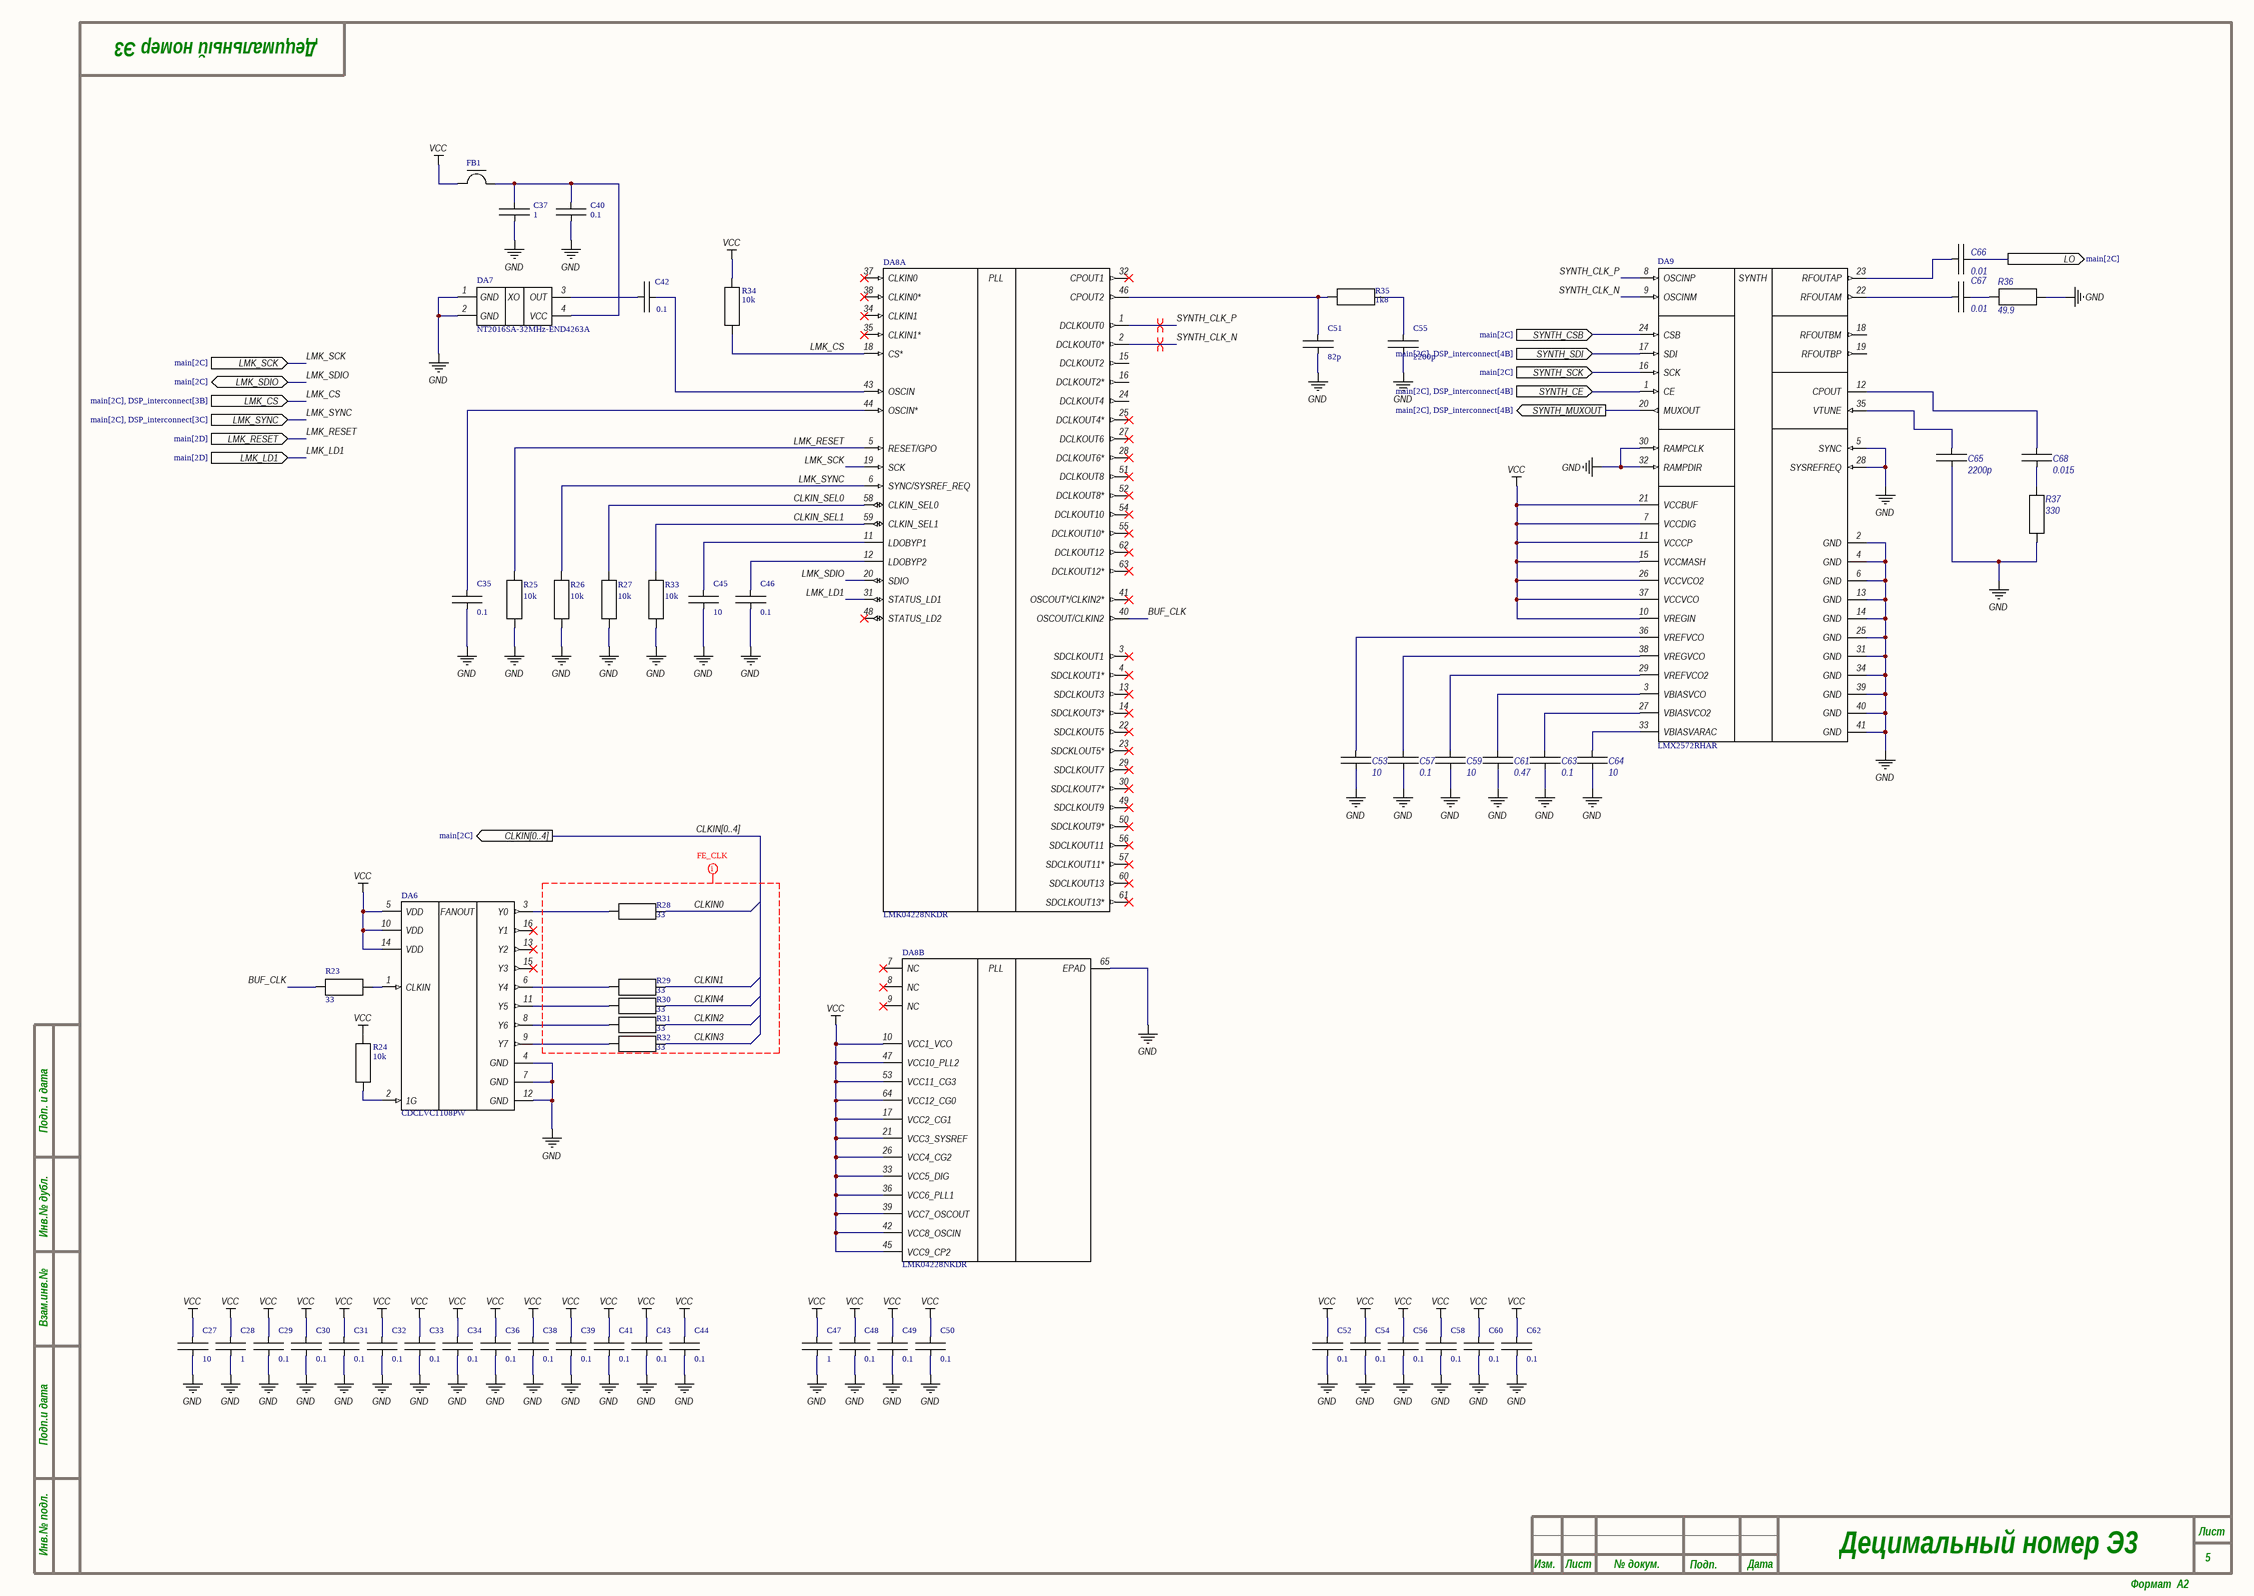
[diagram p4: clock.SchDoc]

### Parts
C27  10  [C0805C]
C28  1  [C0603C]
C29  0.1  [C0603C]
C30  0.1  [C0603C]
C31  0.1  [C0603C]
C32  0.1  [C0603C]
C33  0.1  [C0603C]
C34  0.1  [C0603C]
C35  0.1  [C0603C]
C36  0.1  [C0603C]
C37  1  [C0603C]
C38  0.1  [C0603C]
C39  0.1  [C0603C]
C40  0.1  [C0603C]
C41  0.1  [C0603C]
C42  0.1  [C0603C]
C43  0.1  [C0603C]
C44  0.1  [C0603C]
C45  10  [C0805C]
C46  0.1  [C0603C]
C47  1  [C0603C]
C48  0.1  [C0603C]
C49  0.1  [C0603C]
C50  0.1  [C0603C]
C51  82p  [C0603C]
C52  0.1  [C0603C]
C53  10  [C1206C]
C54  0.1  [C0603C]
C55  2200p  [C0603C]
C56  0.1  [C0603C]
C57  0.1  [C0805C]
C58  0.1  [C0603C]
C59  10  [C1206C]
C60  0.1  [C0603C]
C61  0.47  [C0805C]
C62  0.1  [C0603C]
C63  0.1  [C0805C]
C64  10  [C1206C]
C65  2200p  [C0603C]
C66  0.01  [C0402C]
C67  0.01  [C0402C]
C68  0.015  [C0603C]
DA6  CDCLVC1108PW  [TSSOP16]
DA7  NT2016SA-32MHz-END4263A  [OSC_CX2016DB16000D0WZRC1]
DA8  LMK04228NKDR  [WQFN64_NKD_TEX]  (parts A,B of 2)
DA9  LMX2572RHAR  [RHA0040H]
FB1  (no value)  [C0805I]
R23  33  [C0603R]
R24  10k  [C0603R]
R25  10k  [C0603R]
R26  10k  [C0603R]
R27  10k  [C0603R]
R28  33  [C0603R]
R29  33  [C0603R]
R30  33  [C0603R]
R31  33  [C0603R]
R32  33  [C0603R]
R33  10k  [C0603R]
R34  10k  [C0603R]
R35  1k8  [C0603R]
R36  49.9  [C0402R]
R37  330  [C0603R]

### Ports
CLKIN[0..4] (out, see main[2C]), LMK_CS (in, see main[2C], DSP_interconnect[3B]), LMK_LD1 (in, see main[2D]), LMK_RESET (in, see main[2D]), LMK_SCK (in, see main[2C]), LMK_SDIO (bidir, see main[2C]), LMK_SYNC (in, see main[2C], DSP_interconnect[3C]), LO (out, see main[2C]), SYNTH_CE (in, see main[2C], DSP_interconnect[4B]), SYNTH_CSB (in, see main[2C]), SYNTH_MUXOUT (out, see main[2C], DSP_interconnect[4B]), SYNTH_SCK (in, see main[2C]), SYNTH_SDI (in, see main[2C], DSP_interconnect[4B])

### Nets
GND: C27.2 C28.2 C29.2 C30.2 C31.2 C32.2 C33.2 C34.2 C35.2 C36.2 C37.2 C38.2 C39.2 C40.2 C41.2 C43.2 C44.2 C45.2 C46.2 C47.2 C48.2 C49.2 C50.2 C51.2 C52.2 C53.1 C54.2 C55.2 C56.2 C57.2 C58.2 C59.1 C60.2 C61.1 C62.2 C63.2 C64.1 C65.2 DA6.4(GND) DA6.7(GND) DA6.12(GND) DA7.1(GND) DA7.2(GND) DA8.65(EPAD) DA9.2(GND) DA9.4(GND) DA9.5(SYNC) DA9.6(GND) DA9.13(GND) DA9.14(GND) DA9.25(GND) DA9.28(SYSREFREQ) DA9.30(RAMPCLK) DA9.31(GND) DA9.32(RAMPDIR) DA9.34(GND) DA9.39(GND) DA9.40(GND) DA9.41(GND) R25.2 R26.2 R27.2 R33.2 R36.1 R37.2
VCC: C27.1 C28.1 C29.1 C30.1 C31.1 C32.1 C33.1 C34.1 C36.1 C38.1 C39.1 C41.1 C43.1 C44.1 C47.1 C48.1 C49.1 C50.1 C52.1 C54.1 C56.1 C58.1 C60.1 C62.1 DA6.5(VDD) DA6.10(VDD) DA6.14(VDD) DA8.10(VCC1_VCO) DA8.17(VCC2_CG1) DA8.21(VCC3_SYSREF) DA8.26(VCC4_CG2) DA8.33(VCC5_DIG) DA8.36(VCC6_PLL1) DA8.39(VCC7_OSCOUT) DA8.42(VCC8_OSCIN) DA8.45(VCC9_CP2) DA8.47(VCC10_PLL2) DA8.53(VCC11_CG3) DA8.64(VCC12_CG0) DA9.7(VCCDIG) DA9.10(VREGIN) DA9.11(VCCCP) DA9.15(VCCMASH) DA9.21(VCCBUF) DA9.26(VCCVCO2) DA9.37(VCCVCO) FB1.1 R24.1 R34.1
BUF_CLK: DA8.40(OSCOUT/CLKIN2) R23.2  [project net BUF_CLK_5]
CLKIN0: R28.1  [project net CLK_IN0]
CLKIN1: R29.1  [project net CLK_IN1]
CLKIN2: R31.1  [project net CLK_IN2]
CLKIN3: R32.1  [project net CLK_IN3]
CLKIN4: R30.1  [project net CLK_IN4]
CLKIN_SEL0: DA8.58(CLKIN_SEL0) R27.1  [project net CLKIN_SEL0_5]
CLKIN_SEL1: DA8.59(CLKIN_SEL1) R33.1  [project net CLKIN_SEL1_5]
LMK_CS: DA8.18(CS*) R34.2 ; port LMK_CS
LMK_LD1: DA8.31(STATUS_LD1) ; port LMK_LD1  [project net LMK_LD]
LMK_RESET: DA8.5(RESET/GPO) R25.1 ; port LMK_RESET
LMK_SCK: DA8.19(SCK) ; port LMK_SCK  [project net LMK_CLK]
LMK_SDIO: DA8.20(SDIO) ; port LMK_SDIO  [project net LMK_SD]
LMK_SYNC: DA8.6(SYNC/SYSREF_REQ) R26.1 ; port LMK_SYNC
SYNTH_CE: DA9.1(CE) ; port SYNTH_CE
SYNTH_CLK: DA9.16(SCK) ; port SYNTH_SCK
SYNTH_CLK_N: DA8.2(DCLKOUT0*) DA9.9(OSCINM)  [project net SYNTH_CLK_N_5]
SYNTH_CLK_P: DA8.1(DCLKOUT0) DA9.8(OSCINP)  [project net SYNTH_CLK_P_5]
SYNTH_CS: DA9.24(CSB) ; port SYNTH_CSB
SYNTH_MOSI: DA9.17(SDI) ; port SYNTH_SDI
SYNTH_MUXOUT: DA9.20(MUXOUT) ; port SYNTH_MUXOUT
NetC35_1: C35.1 DA8.44(OSCIN*)
NetC37_1: C37.1 C40.1 DA7.4(VCC) FB1.2
NetC42_1: C42.1 DA7.3(OUT)
NetC42_2: C42.2 DA8.43(OSCIN)
NetC45_1: C45.1 DA8.11(LDOBYP1)
NetC46_1: C46.1 DA8.12(LDOBYP2)
NetC51_1: C51.1 DA8.46(CPOUT2) R35.2
NetC53_2: C53.2 DA9.36(VREFVCO)
NetC55_1: C55.1 R35.1
NetC57_1: C57.1 DA9.38(VREGVCO)
NetC59_2: C59.2 DA9.29(VREFVCO2)
NetC61_2: C61.2 DA9.3(VBIASVCO)
NetC63_1: C63.1 DA9.27(VBIASVCO2)
NetC64_2: C64.2 DA9.33(VBIASVARAC)
NetC65_1: C65.1 DA9.35(VTUNE)
NetC66_1: C66.1 DA9.23(RFOUTAP)
NetC66_2: C66.2 ; port LO
NetC67_1: C67.1 DA9.22(RFOUTAM)
NetC67_2: C67.2 R36.2
NetC68_1: C68.1 DA9.12(CPOUT)
NetC68_2: C68.2 R37.1
NetDA6_1: DA6.1(CLKIN) R23.1
NetDA6_2: DA6.2(1G) R24.2
NetDA6_3: DA6.3(Y0) R28.2
NetDA6_6: DA6.6(Y4) R29.2
NetDA6_8: DA6.8(Y6) R31.2
NetDA6_9: DA6.9(Y7) R32.2
NetDA6_11: DA6.11(Y5) R30.2

Not connected (* = marked no-connect by the designer): DA6 13(Y2)* 15(Y3)* 16(Y1)*; DA8 3(SDCLKOUT1)* 4(SDCLKOUT1*)* 7(NC)* 8(NC)* 9(NC)* 13(SDCLKOUT3)* 14(SDCLKOUT3*)* 15(DCLKOUT2) 16(DCLKOUT2*) 22(SDCLKOUT5)* 23(SDCKLOUT5*)* 24(DCLKOUT4) 25(DCLKOUT4*)* 27(DCLKOUT6)* 28(DCLKOUT6*)* 29(SDCLKOUT7)* 30(SDCLKOUT7*)* 32(CPOUT1)* 34(CLKIN1)* 35(CLKIN1*)* 37(CLKIN0)* 38(CLKIN0*)* 41(OSCOUT*/CLKIN2*)* 48(STATUS_LD2)* 49(SDCLKOUT9)* 50(SDCLKOUT9*)* 51(DCLKOUT8)* 52(DCLKOUT8*)* 54(DCLKOUT10)* 55(DCLKOUT10*)* 56(SDCLKOUT11)* 57(SDCLKOUT11*)* 60(SDCLKOUT13)* 61(SDCLKOUT13*)* 62(DCLKOUT12)* 63(DCLKOUT12*)*; DA9 18(RFOUTBM) 19(RFOUTBP)

### Buses and harness runs
bus CLKIN[0..4] = port CLKIN[0..4]

### Layout directives
differential pair: SYNTH_CLK_N_5, SYNTH_CLK_P_5
net class FE_SYNC_CLK: CLKIN0, CLKIN1, CLKIN2, CLKIN3, CLKIN4

### Notes on the sheet
- Подп. и дата
- Инв.№ дубл.
- Взам.инв.№
- Подп.и дата
- Инв.№ подл.
- Изм.
- Лист
- № докум.
- Подп.
- Дата
- Формат  A2
- (in symbol CDCLVC1108PW) FANOUT
- (in symbol LMK04228NKDR, part A) PLL
- (in symbol LMK04228NKDR, part B) PLL
- (in symbol LMX2572RHAR) SYNTH
- (in symbol TCXO) XO

### Library data of the parts
C27-C52 C54-C56 C58 C60 C62 = Cap: TYPE: Capacitor; MAPPING: 2(1,2,100)(1,2,100)
  C27 C45: Value: 10
  C28 C37 C47: Value: 1
  C29-C36 C38-C44 C46 C48-C50 C52 C54 C56 C58 C60 C62: Value: 0.1
  C51: Value: 82p
  C55: Value: 2200p
C53 C57 C59 C61 C63-C68 = Cap
  C53 C59 C64: Value: 10
  C57 C63: Value: 0.1
  C61: Value: 0.47
  C65: Value: 2200p
  C66 C67: Value: 0.01
  C68: Value: 0.015
DA6 = CDCLVC1108PW: Low jitter, 1:8 LVCMOS fan-out clock buffer 16-TSSOP -40 to 85; Manufacturer_Name: Texas Instruments; PartNumber: CDCLVC1108PWR; CompType: IC; TYPE: TYPE; RefDes: RefDes; Copyright: Copyright (C) 2026 Ultra Librarian. All rights reserved.; Manufacturer_Part_Number: CDCLVC1108PW; Datasheet: https://www.ti.com/lit/gpn/cdclvc1108; Application_BuildNumber: *; Alternate_PartNumber: CDCLVC1108PW; PackageReference: PW0016A; MountType: SMT; RoHS: Y; Manufacturer: Texas Instruments
DA7 = TCXO: Part number: NT2016SA-32MHz-END4263A
DA8 = LMK04228NKDR: Ultra low-noise clock jitter cleaner with dual loop PLLs 64-WQFN -40 to 85; Manufacturer_Name: Texas Instruments; Copyright: Copyright (C) 2026 Ultra Librarian. All rights reserved.; Manufacturer_Part_Number: LMK04228NKDR; Datasheet: https://www.ti.com/lit/gpn/lmk04228; RefDes: RefDes; Type: Type
DA9 = LMX2572RHAR: 6.4-GHz low-power wideband RF synthesizer 40-VQFN -40 to 85; Manufacturer_Name: Texas Instruments; TYPE: TYPE; RefDes: RefDes; Copyright: Copyright (C) 2026 Ultra Librarian. All rights reserved.; Manufacturer_Part_Number: LMX2572RHAR
FB1 = FBEAD
R23 R24 R28-R32 R34 R35 = res: MAPPING: 2(1,2,100)(1,2,100); TYPE: Resistor
  R23 R28-R32: Value: 33
  R24 R34: Value: 10k
  R35: Value: 1k8
R25-R27 R33 R36 R37 = res
  R25-R27 R33: Value: 10k
  R36: Value: 49.9
  R37: Value: 330

## Sheet frontend_tx.SchDoc: Наименование
size 420 x 297 mm; ApprovedBy: Утвердил; CheckedBy: Проверил; Author: Разработал; CompanyName: ВлГУ; DrawnBy: Н.Контр; Engineer: Т.Контр; SheetNumber: 7; SheetTotal: 9; PageSetup: Record=PageOptions|CenterHorizontal=True|CenterVertical=True|PrintScale=0.94|XCorrection=1.00|YCorrection=1.00|PrintKind=1|BorderSize=5000000|LeftOffset=0|BottomOffset=0|Orientation=1|PaperLength=1000|PaperWidth=1000|Scale=100|PaperSource=7|PrintQuality=-4|MediaType=1|DitherType=10|PaperKind=A4|PrintScaleMode=1; DecimalNumber: Децимальный номер; HeadOfSector: Нач. сектора; MainDevice: Перв.примен.; Name: Наименование; DocumentName: Sheet1.SCHDOC
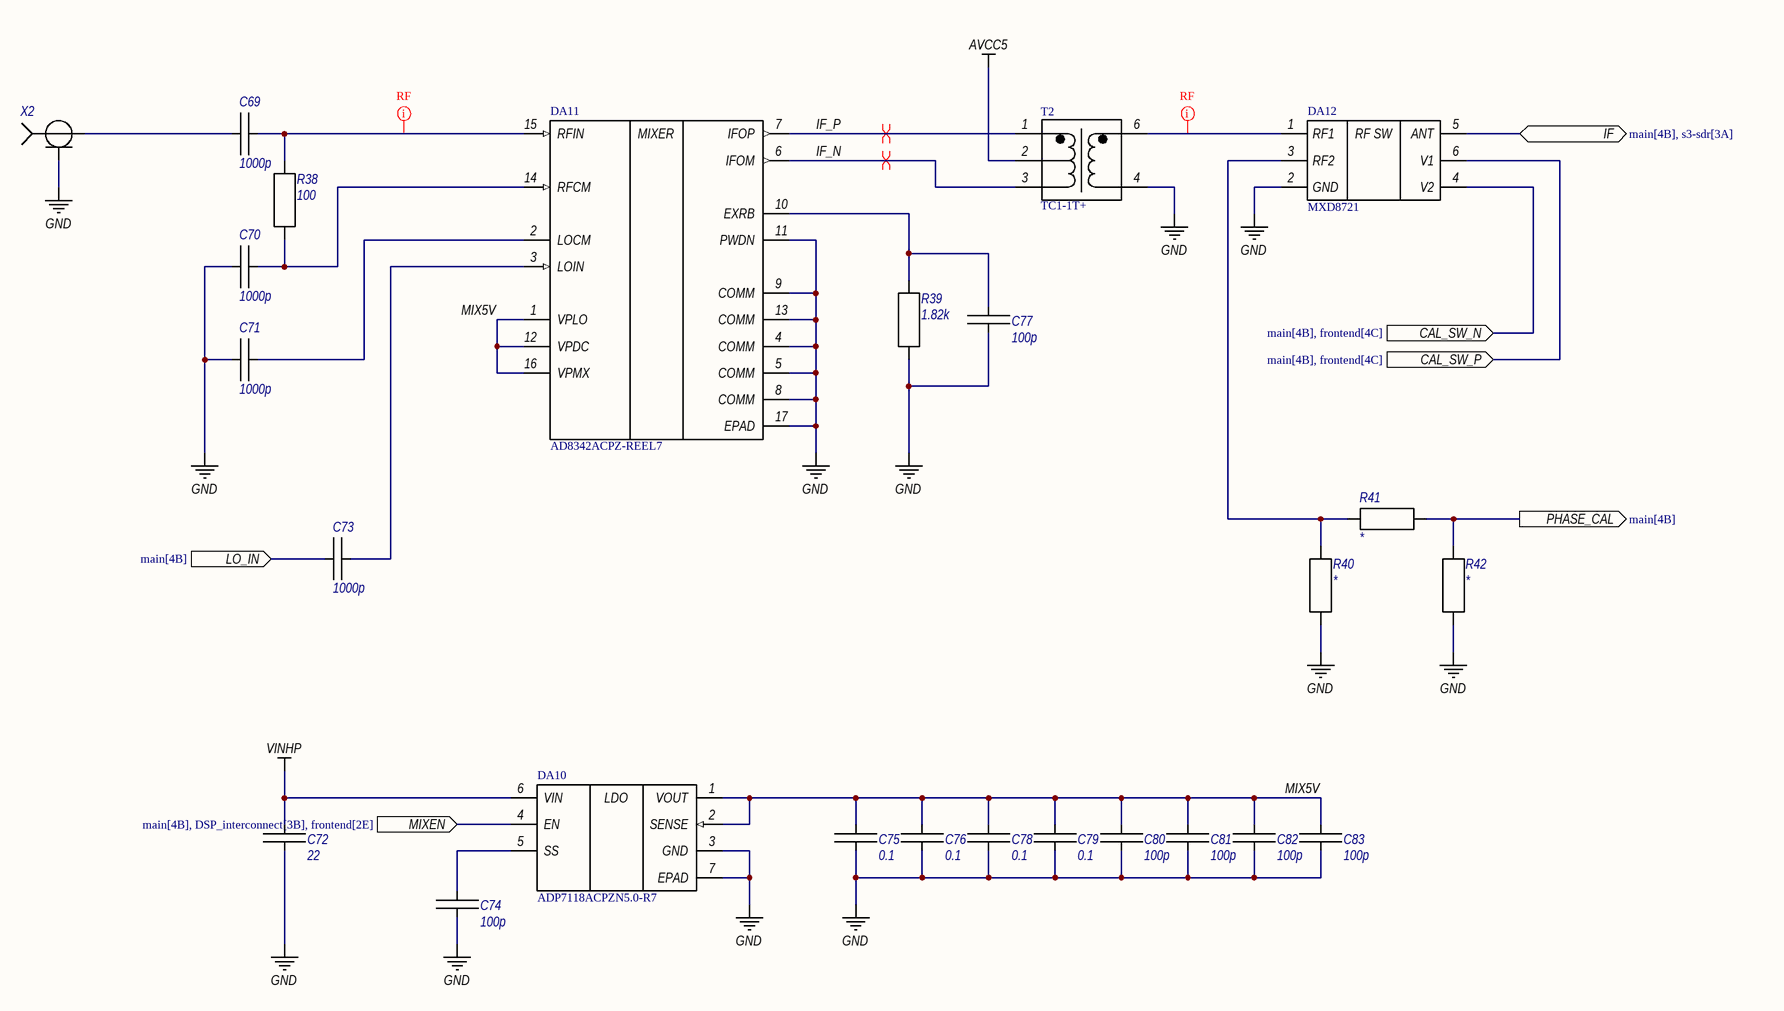
[diagram p5: frontend_tx.SchDoc]

### Parts
C69  1000p  [C0402C]
C70  1000p  [C0402C]
C71  1000p  [C0402C]
C72  22  [C0805C]
C73  1000p  [C0402C]
C74  100p  [C0603C]
C75  0.1  [C0805C]
C76  0.1  [C0805C]
C77  100p  [C0603C]
C78  0.1  [C0805C]
C79  0.1  [C0805C]
C80  100p  [C0603C]
C81  100p  [C0603C]
C82  100p  [C0603C]
C83  100p  [C0603C]
DA10  ADP7118ACPZN5.0-R7  [CP-6-3_ADI]
DA11  AD8342ACPZ-REEL7  [CP_16_27_ADI-M]
DA12  MXD8721  [SON35P100X50-6N]
R38  100  [C0603R]
R39  1.82k  [C0603R]
R40  *  [C0402R]
R41  *  [C0402R]
R42  *  [C0402R]
T2  TC1-1T+  [AT224-1A_MNC]
X2  (no value)  [IPEX PAD]

### Ports
CAL_SW_N (in, see main[4B], frontend[4C]), CAL_SW_P (in, see main[4B], frontend[4C]), IF (bidir, see main[4B], s3-sdr[3A]), LO_IN (in, see main[4B]), MIXEN (in, see main[4B], DSP_interconnect[3B], frontend[2E]), PHASE_CAL (out, see main[4B])

### Nets
AVCC5: T2.2(SCONDARY_CT)
GND: C70.1 C71.1 C72.2 C74.2 C75.2 C76.2 C77.2 C78.2 C79.2 C80.2 C81.2 C82.2 C83.2 DA10.3(GND) DA10.7(EPAD) DA11.4(COMM) DA11.5(COMM) DA11.8(COMM) DA11.9(COMM) DA11.11(PWDN) DA11.13(COMM) DA11.17(EPAD) DA12.2(GND) R39.2 R40.2 R42.2 T2.4(PRIMARY) X2.2
VINHP: C72.1 DA10.6(VIN)
CAL_SW_N: DA12.4(V2) ; port CAL_SW_N
CAL_SW_P: DA12.6(V1) ; port CAL_SW_P
IF: DA12.5(ANT) ; port IF
IF_N: DA11.6(IFOM) T2.3(SECONDARY)  [project net IF_N_7]
IF_P: DA11.7(IFOP) T2.1(SECONDARY_DOT)  [project net IF_P_7]
MIX5V: C75.1 C76.1 C78.1 C79.1 C80.1 C81.1 C82.1 C83.1 DA10.1(VOUT) DA10.2(SENSE) DA11.1(VPLO) DA11.12(VPDC) DA11.16(VPMX)  [project net MIX5V_7]
MIXEN: DA10.4(EN) ; port MIXEN
PHASE_CAL: R41.1 R42.1 ; port PHASE_CAL
NetC69_1: C69.1 X2.1
NetC69_2: C69.2 DA11.15(RFIN) R38.1
NetC70_2: C70.2 DA11.14(RFCM) R38.2
NetC71_2: C71.2 DA11.2(LOCM)
NetC73_1: C73.1 ; port LO_IN
NetC73_2: C73.2 DA11.3(LOIN)
NetC74_1: C74.1 DA10.5(SS)
NetC77_1: C77.1 DA11.10(EXRB) R39.1
NetDA12_1: DA12.1(RF1) T2.6(PRIMARY_DOT)
NetDA12_3: DA12.3(RF2) R40.1 R41.2

### Layout directives
net class RF: NetC69_2, NetDA12_1
differential pair: IF_N_7, IF_P_7

### Notes on the sheet
- Подп. и дата
- Инв.№ дубл.
- Взам.инв.№
- Подп.и дата
- Инв.№ подл.
- Изм.
- Лист
- № докум.
- Подп.
- Дата
- Формат  A3
- (in symbol AD8342ACPZ-REEL7) MIXER
- (in symbol ADP7118ACPZN5.0-R7) LDO
- (in symbol MXD8721) RF SW

### Library data of the parts
C69-C83 = Cap
  C69-C71 C73: Value: 1000p
  C72: Value: 22
  C74 C77 C80-C83: Value: 100p
  C75 C76 C78 C79: Value: 0.1
DA10 = ADP7118ACPZN5.0-R7: as DA4 on sheet frontend; Copyright: Copyright (C) 2026 Ultra Librarian. All rights reserved.; Manufacturer_Part_Number: ADP7118ACPZN5.0-R7; Datasheet: https://www.analog.com/media/en/technical-documentation/data-sheets/adp7118.pdf; RefDes: RefDes; Type: Type
DA11 = AD8342ACPZ-REEL7: as DA3 on sheet frontend; Copyright: Copyright (C) 2025 Ultra Librarian. All rights reserved.; Manufacturer_Part_Number: AD8342ACPZ-REEL7; RefDes: RefDes; Type: Type
DA12 = MXD8721: 0.5-6.0GHz SPDT Switch; Part number: MXD8721
R38-R42 = res
  R38: Value: 100
  R39: Value: 1.82k
  R40-R42: Value: *
T2 = TC1-1T+: as T1 on sheet frontend; Copyright: Copyright (C) 2026 Ultra Librarian. All rights reserved.; Manufacturer_Part_Number: TC1-1T+; RefDes: RefDes
X2 = Ipex

## Sheet power.SchDoc: Наименование
size 420 x 297 mm; ApprovedBy: Утвердил; CheckedBy: Проверил; Author: Разработал; CompanyName: ВлГУ; DrawnBy: Н.Контр; Engineer: Т.Контр; SheetNumber: 8; SheetTotal: 9; PageSetup: Record=PageOptions|CenterHorizontal=True|CenterVertical=True|PrintScale=0.94|XCorrection=1.00|YCorrection=1.00|PrintKind=1|BorderSize=5000000|LeftOffset=0|BottomOffset=0|Orientation=1|PaperLength=1000|PaperWidth=1000|Scale=100|PaperSource=7|PrintQuality=-4|MediaType=1|DitherType=10|PaperKind=A4|PrintScaleMode=1; DecimalNumber: Децимальный номер; HeadOfSector: Нач. сектора; MainDevice: Перв.примен.; Name: Наименование; DocumentName: Sheet1.SCHDOC
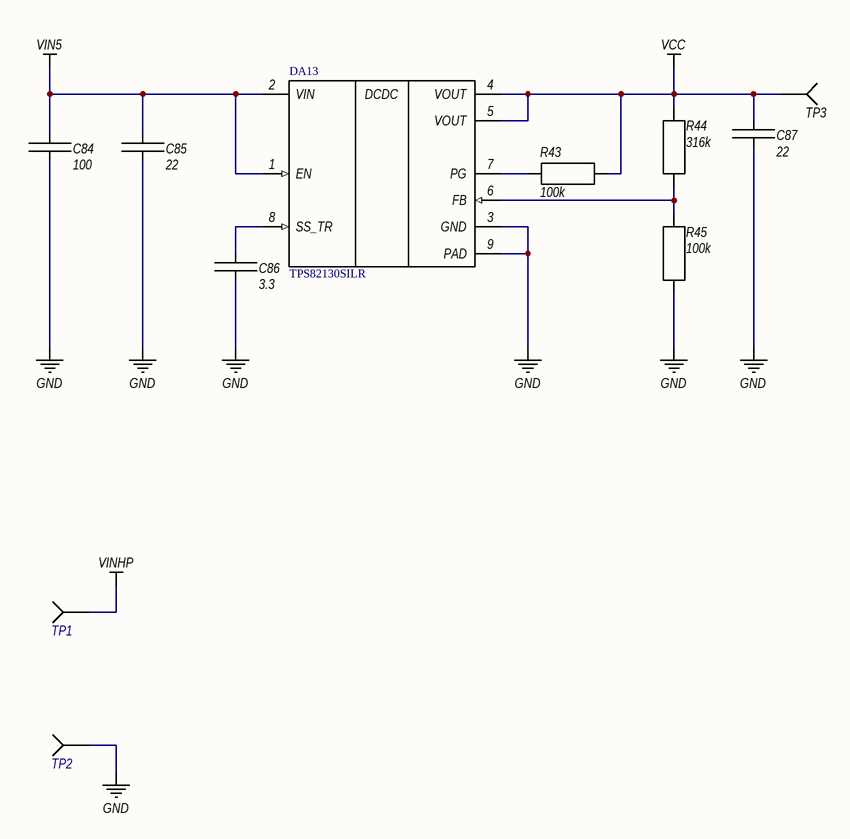
[diagram p6: power.SchDoc]

### Parts
C84  100  [C1206C]
C85  22  [C0805C]
C86  3.3  [C0805C]
C87  22  [C0805C]
DA13  TPS82130SILR  [SIL0008D_SMD]
R43  100k  [C0805R]
R44  316k  [C0805R]
R45  100k  [C0805R]
TP1  (no value)  [TestPoint]  (no BOM)
TP2  (no value)  [TestPoint]  (no BOM)
TP3  (no value)  [TestPoint]  (no BOM)

### Nets
GND: C84.2 C85.2 C86.2 C87.2 DA13.3(GND) DA13.9(PAD) R45.2 TP2.1
VCC: C87.1 DA13.4(VOUT) DA13.5(VOUT) R43.1 R44.2 TP3.1
VIN5: C84.1 C85.1 DA13.1(EN) DA13.2(VIN)
VINHP: TP1.1
NetC86_1: C86.1 DA13.8(SS_TR)
NetDA13_6: DA13.6(FB) R44.1 R45.1
NetDA13_7: DA13.7(PG) R43.2

### Notes on the sheet
- Подп. и дата
- Инв.№ дубл.
- Взам.инв.№
- Подп.и дата
- Инв.№ подл.
- Изм.
- Лист
- № докум.
- Подп.
- Дата
- Формат  A3
- (in symbol TPS82130SILR) DCDC

### Library data of the parts
C84 = Cap: Part number: GRM31CR60J107ME39L; Value: 100
C85-C87 = Cap
  C85 C87: Value: 22
  C86: Value: 3.3
DA13 = TPS82130SILR: 17-V input 3-A step-down converter module with integrated inductor 8-uSiP -40 to 125; Manufacturer_Name: Texas Instruments; TYPE: TYPE; RefDes: RefDes; Copyright: Copyright (C) 2025 Ultra Librarian. All rights reserved.; Manufacturer_Part_Number: TPS82130SILR; Datasheet: https://www.ti.com/lit/gpn/tps82130
R43-R45 = res
  R43 R45: Value: 100k
  R44: Value: 316k
TP1-TP3 = TestPoint

## Sheet DSP_interconnect.SchDoc: Наименование
size 420 x 297 mm; ApprovedBy: Утвердил; CheckedBy: Проверил; Author: Разработал; CompanyName: ВлГУ; DrawnBy: Н.Контр; Engineer: Т.Контр; SheetNumber: 4; SheetTotal: 9; PageSetup: Record=PageOptions|CenterHorizontal=True|CenterVertical=True|PrintScale=0.94|XCorrection=1.00|YCorrection=1.00|PrintKind=1|BorderSize=5000000|LeftOffset=0|BottomOffset=0|Orientation=1|PaperLength=1000|PaperWidth=1000|Scale=100|PaperSource=7|PrintQuality=-4|MediaType=1|DitherType=10|PaperKind=A4|PrintScaleMode=1; DecimalNumber: Децимальный номер; HeadOfSector: Нач. сектора; MainDevice: Перв.примен.; Name: Наименование; DocumentName: Sheet1.SCHDOC
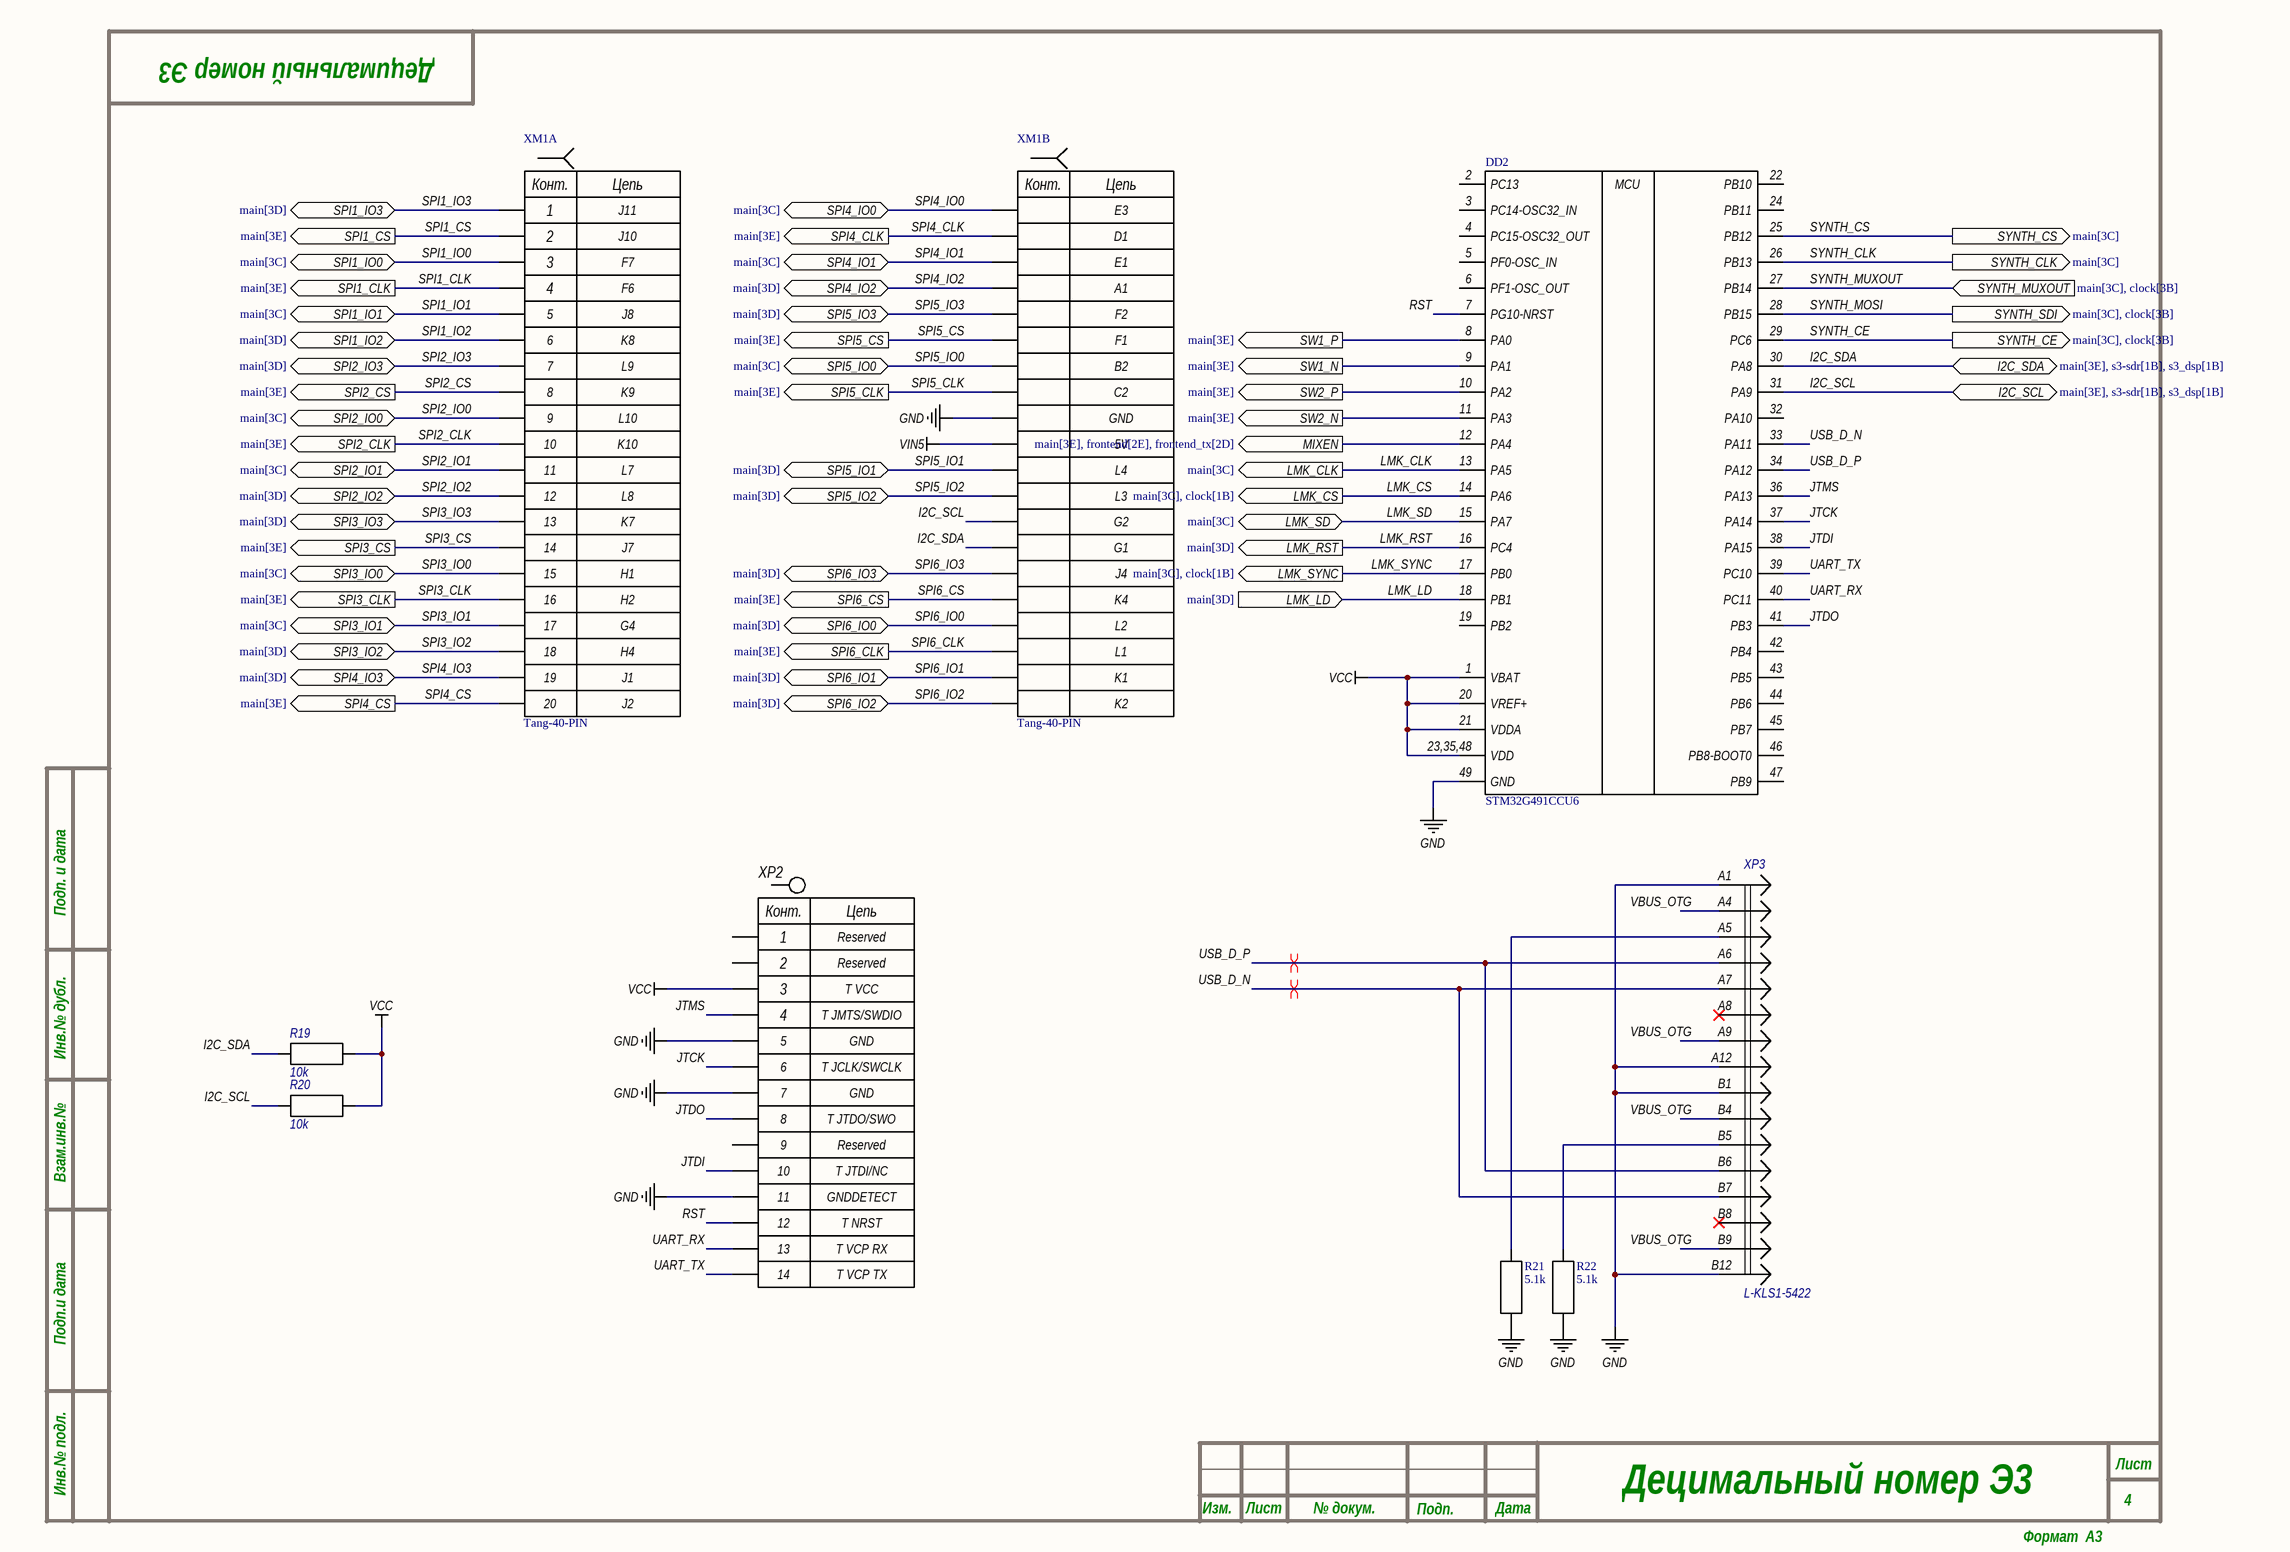
[diagram p7: DSP_interconnect.SchDoc]

### Parts
DD2  STM32G491CCU6  [QFN48]
R19  10k  [C0805R]
R20  10k  [C0805R]
R21  5.1k  [C0805R]
R22  5.1k  [C0805R]
XM1  Tang-40-PIN  [TANG-40PIN]  (parts A,B of 2)
XP2  ConnectorPin-6_Table  [PLLD-1.27-14S]  (value not drawn)
XP3  L-KLS1-5422  [L-KLS1-5422]

### Ports
I2C_SCL (bidir, see main[3E], s3-sdr[1B], s3_dsp[1B]), I2C_SDA (bidir, see main[3E], s3-sdr[1B], s3_dsp[1B]), LMK_CLK (out, see main[3C]), LMK_CS (out, see main[3C], clock[1B]), LMK_LD (in, see main[3D]), LMK_RST (out, see main[3D]), LMK_SD (bidir, see main[3C]), LMK_SYNC (out, see main[3C], clock[1B]), MIXEN (out, see main[3E], frontend[2E], frontend_tx[2D]), SPI1_CLK (out, see main[3E]), SPI1_CS (out, see main[3E]), SPI1_IO0 (bidir, see main[3C]), SPI1_IO1 (bidir, see main[3C]), SPI1_IO2 (bidir, see main[3D]), SPI1_IO3 (bidir, see main[3D]), SPI2_CLK (out, see main[3E]), SPI2_CS (out, see main[3E]), SPI2_IO0 (bidir, see main[3C]), SPI2_IO1 (bidir, see main[3C]), SPI2_IO2 (bidir, see main[3D]), SPI2_IO3 (bidir, see main[3D]), SPI3_CLK (out, see main[3E]), SPI3_CS (out, see main[3E]), SPI3_IO0 (bidir, see main[3C]), SPI3_IO1 (bidir, see main[3C]), SPI3_IO2 (bidir, see main[3D]), SPI3_IO3 (bidir, see main[3D]), SPI4_CLK (out, see main[3E]), SPI4_CS (out, see main[3E]), SPI4_IO0 (bidir, see main[3C]), SPI4_IO1 (bidir, see main[3C]), SPI4_IO2 (bidir, see main[3D]), SPI4_IO3 (bidir, see main[3D]), SPI5_CLK (out, see main[3E]), SPI5_CS (out, see main[3E]), SPI5_IO0 (bidir, see main[3C]), SPI5_IO1 (bidir, see main[3D]), SPI5_IO2 (bidir, see main[3D]), SPI5_IO3 (bidir, see main[3D]), SPI6_CLK (out, see main[3E]), SPI6_CS (out, see main[3E]), SPI6_IO0 (bidir, see main[3D]), SPI6_IO1 (bidir, see main[3D]), SPI6_IO2 (bidir, see main[3D]), SPI6_IO3 (bidir, see main[3D]), SW1_N (out, see main[3E]), SW1_P (out, see main[3E]), SW2_N (out, see main[3E]), SW2_P (out, see main[3E]), SYNTH_CE (out, see main[3C], clock[3B]), SYNTH_CLK (out, see main[3C]), SYNTH_CS (out, see main[3C]), SYNTH_MUXOUT (in, see main[3C], clock[3B]), SYNTH_SDI (out, see main[3C], clock[3B])

### Nets
GND: DD2.49(GND) R21.2 R22.2 XM1.29 XP2.5 XP2.7 XP2.11 XP3.A1 XP3.A12 XP3.B1 XP3.B12
VCC: DD2.1(VBAT) DD2.20(VREF+) DD2.21(VDDA) DD2.23,35,48(VDD) R19.2 R20.2 XP2.3
VIN5: XM1.30
CAL_SW_N: DD2.9(PA1) ; port SW1_N
CAL_SW_P: DD2.8(PA0) ; port SW1_P
I2C_SCL: DD2.31(PA9) R20.1 XM1.33 ; port I2C_SCL
I2C_SDA: DD2.30(PA8) R19.1 XM1.34 ; port I2C_SDA
JTCK: DD2.37(PA14) XP2.6  [project net JTCK_4]
JTDI: DD2.38(PA15) XP2.10  [project net JTDI_4]
JTDO: DD2.41(PB3) XP2.8  [project net JTDO_4]
JTMS: DD2.36(PA13) XP2.4  [project net JTMS_4]
LMK_CLK: DD2.13(PA5) ; port LMK_CLK
LMK_CS: DD2.14(PA6) ; port LMK_CS
LMK_LD: DD2.18(PB1) ; port LMK_LD
LMK_RST: DD2.16(PC4) ; port LMK_RST  [project net LMK_RESET]
LMK_SD: DD2.15(PA7) ; port LMK_SD
LMK_SYNC: DD2.17(PB0) ; port LMK_SYNC
MIXEN: DD2.12(PA4) ; port MIXEN
PL_SW_N: DD2.11(PA3) ; port SW2_N
PL_SW_P: DD2.10(PA2) ; port SW2_P
RST: DD2.7(PG10-NRST) XP2.12  [project net RST_4]
SPI1_CLK: XM1.4 ; port SPI1_CLK  [project net CLK]
SPI1_CS: XM1.2 ; port SPI1_CS  [project net CS0]
SPI1_IO0: XM1.3 ; port SPI1_IO0  [project net IO0]
SPI1_IO1: XM1.5 ; port SPI1_IO1  [project net IO1]
SPI1_IO2: XM1.6 ; port SPI1_IO2  [project net IO2]
SPI1_IO3: XM1.1 ; port SPI1_IO3  [project net IO3]
SPI2_CLK: XM1.10 ; port SPI2_CLK  [project net CLK]
SPI2_CS: XM1.8 ; port SPI2_CS  [project net CS0]
SPI2_IO0: XM1.9 ; port SPI2_IO0  [project net IO0]
SPI2_IO1: XM1.11 ; port SPI2_IO1  [project net IO1]
SPI2_IO2: XM1.12 ; port SPI2_IO2  [project net IO2]
SPI2_IO3: XM1.7 ; port SPI2_IO3  [project net IO3]
SPI3_CLK: XM1.16 ; port SPI3_CLK  [project net CLK]
SPI3_CS: XM1.14 ; port SPI3_CS  [project net CS0]
SPI3_IO0: XM1.15 ; port SPI3_IO0  [project net IO0]
SPI3_IO1: XM1.17 ; port SPI3_IO1  [project net IO1]
SPI3_IO2: XM1.18 ; port SPI3_IO2  [project net IO2]
SPI3_IO3: XM1.13 ; port SPI3_IO3  [project net IO3]
SPI4_CLK: XM1.22 ; port SPI4_CLK  [project net CLK]
SPI4_CS: XM1.20 ; port SPI4_CS  [project net CS0]
SPI4_IO0: XM1.21 ; port SPI4_IO0  [project net IO0]
SPI4_IO1: XM1.23 ; port SPI4_IO1  [project net IO1]
SPI4_IO2: XM1.24 ; port SPI4_IO2  [project net IO2]
SPI4_IO3: XM1.19 ; port SPI4_IO3  [project net IO3]
SPI5_CLK: XM1.28 ; port SPI5_CLK  [project net CLK]
SPI5_CS: XM1.26 ; port SPI5_CS  [project net CS0]
SPI5_IO0: XM1.27 ; port SPI5_IO0  [project net IO0]
SPI5_IO1: XM1.31 ; port SPI5_IO1  [project net IO1]
SPI5_IO2: XM1.32 ; port SPI5_IO2  [project net IO2]
SPI5_IO3: XM1.25 ; port SPI5_IO3  [project net IO3]
SPI6_CLK: XM1.38 ; port SPI6_CLK  [project net CLK]
SPI6_CS: XM1.36 ; port SPI6_CS  [project net CS]
SPI6_IO0: XM1.37 ; port SPI6_IO0  [project net IO0]
SPI6_IO1: XM1.39 ; port SPI6_IO1  [project net IO1]
SPI6_IO2: XM1.40 ; port SPI6_IO2  [project net IO2]
SPI6_IO3: XM1.35 ; port SPI6_IO3  [project net IO3]
SYNTH_CE: DD2.29(PC6) ; port SYNTH_CE
SYNTH_CLK: DD2.26(PB13) ; port SYNTH_CLK
SYNTH_CS: DD2.25(PB12) ; port SYNTH_CS
SYNTH_MOSI: DD2.28(PB15) ; port SYNTH_SDI
SYNTH_MUXOUT: DD2.27(PB14) ; port SYNTH_MUXOUT
UART_RX: DD2.40(PC11) XP2.13  [project net UART_RX_4]
UART_TX: DD2.39(PC10) XP2.14  [project net UART_TX_4]
USB_D_N: DD2.33(PA11) XP3.A7 XP3.B7  [project net USB_D_N_4]
USB_D_P: DD2.34(PA12) XP3.A6 XP3.B6  [project net USB_D_P_4]
VBUS_OTG: XP3.A4 XP3.A9 XP3.B4 XP3.B9  [project net VBUS_OTG_4]
NetR21_1: R21.1 XP3.A5
NetR22_1: R22.1 XP3.B5

Not connected (* = marked no-connect by the designer): DD2 2(PC13) 3(PC14-OSC32_IN) 4(PC15-OSC32_OUT) 5(PF0-OSC_IN) 6(PF1-OSC_OUT) 19(PB2) 22(PB10) 24(PB11) 32(PA10) 42(PB4) 43(PB5) 44(PB6) 45(PB7) 46(PB8-BOOT0) 47(PB9); XP2 1 2 9; XP3 A8* B8*

### Layout directives
differential pair: USB_D_N_4, USB_D_P_4

### Notes on the sheet
- Подп. и дата
- Инв.№ дубл.
- Взам.инв.№
- Подп.и дата
- Инв.№ подл.
- Изм.
- Лист
- № докум.
- Подп.
- Дата
- Формат  A3
- (in symbol STDC-14) Конт.; Цепь; Reserved; T VCC; T JMTS/SWDIO; GND; T JCLK/SWCLK; T JTDO/SWO; T JTDI/NC; GNDDETECT; T NRST; T VCP RX; T VCP TX
- (in symbol STM32G491CCU6) MCU
- (in symbol Tang-40-PIN, part A) Конт.; Цепь; J11; J10; F7; F6; J8; K8; L9; K9; L10; K10; L7; L8; K7; J7; H1; H2; G4; H4; J1; J2
- (in symbol Tang-40-PIN, part B) Конт.; Цепь; E3; D1; E1; A1; F2; F1; B2; C2; GND; 5V; L4; L3; G2; G1; J4; K4; L2; L1; K1; K2

### Library data of the parts
DD2 = STM32G491CCU6: Mainstream Arm Cortex-M4 MCU 170 MHz with 256 Kbytes of Flash memory, Math Accelerator, High Analog level integration
R19 R20 = res: Value: 10k
R21 R22 = res: MAPPING: 2(1,2,100)(1,2,100); Value: 5.1k; TYPE: Resistor
XP2 = STDC-14
XP3 = L-KLS1-5422: as XP1 on sheet s3-sdr; Part number: L-KLS1-5422

## Sheet s3_dsp.SchDoc: Наименование
size 420 x 297 mm; ApprovedBy: Утвердил; CheckedBy: Проверил; Author: Разработал; CompanyName: ВлГУ; DrawnBy: Н.Контр; Engineer: Т.Контр; SheetNumber: 9; SheetTotal: 9; PageSetup: Record=PageOptions|CenterHorizontal=True|CenterVertical=True|PrintScale=0.94|XCorrection=1.00|YCorrection=1.00|PrintKind=1|BorderSize=5000000|LeftOffset=0|BottomOffset=0|Orientation=1|PaperLength=1000|PaperWidth=1000|Scale=100|PaperSource=7|PrintQuality=-4|MediaType=1|DitherType=10|PaperKind=A4|PrintScaleMode=1; DecimalNumber: Децимальный номер; HeadOfSector: Нач. сектора; MainDevice: Перв.примен.; Name: Наименование; DocumentName: Sheet1.SCHDOC
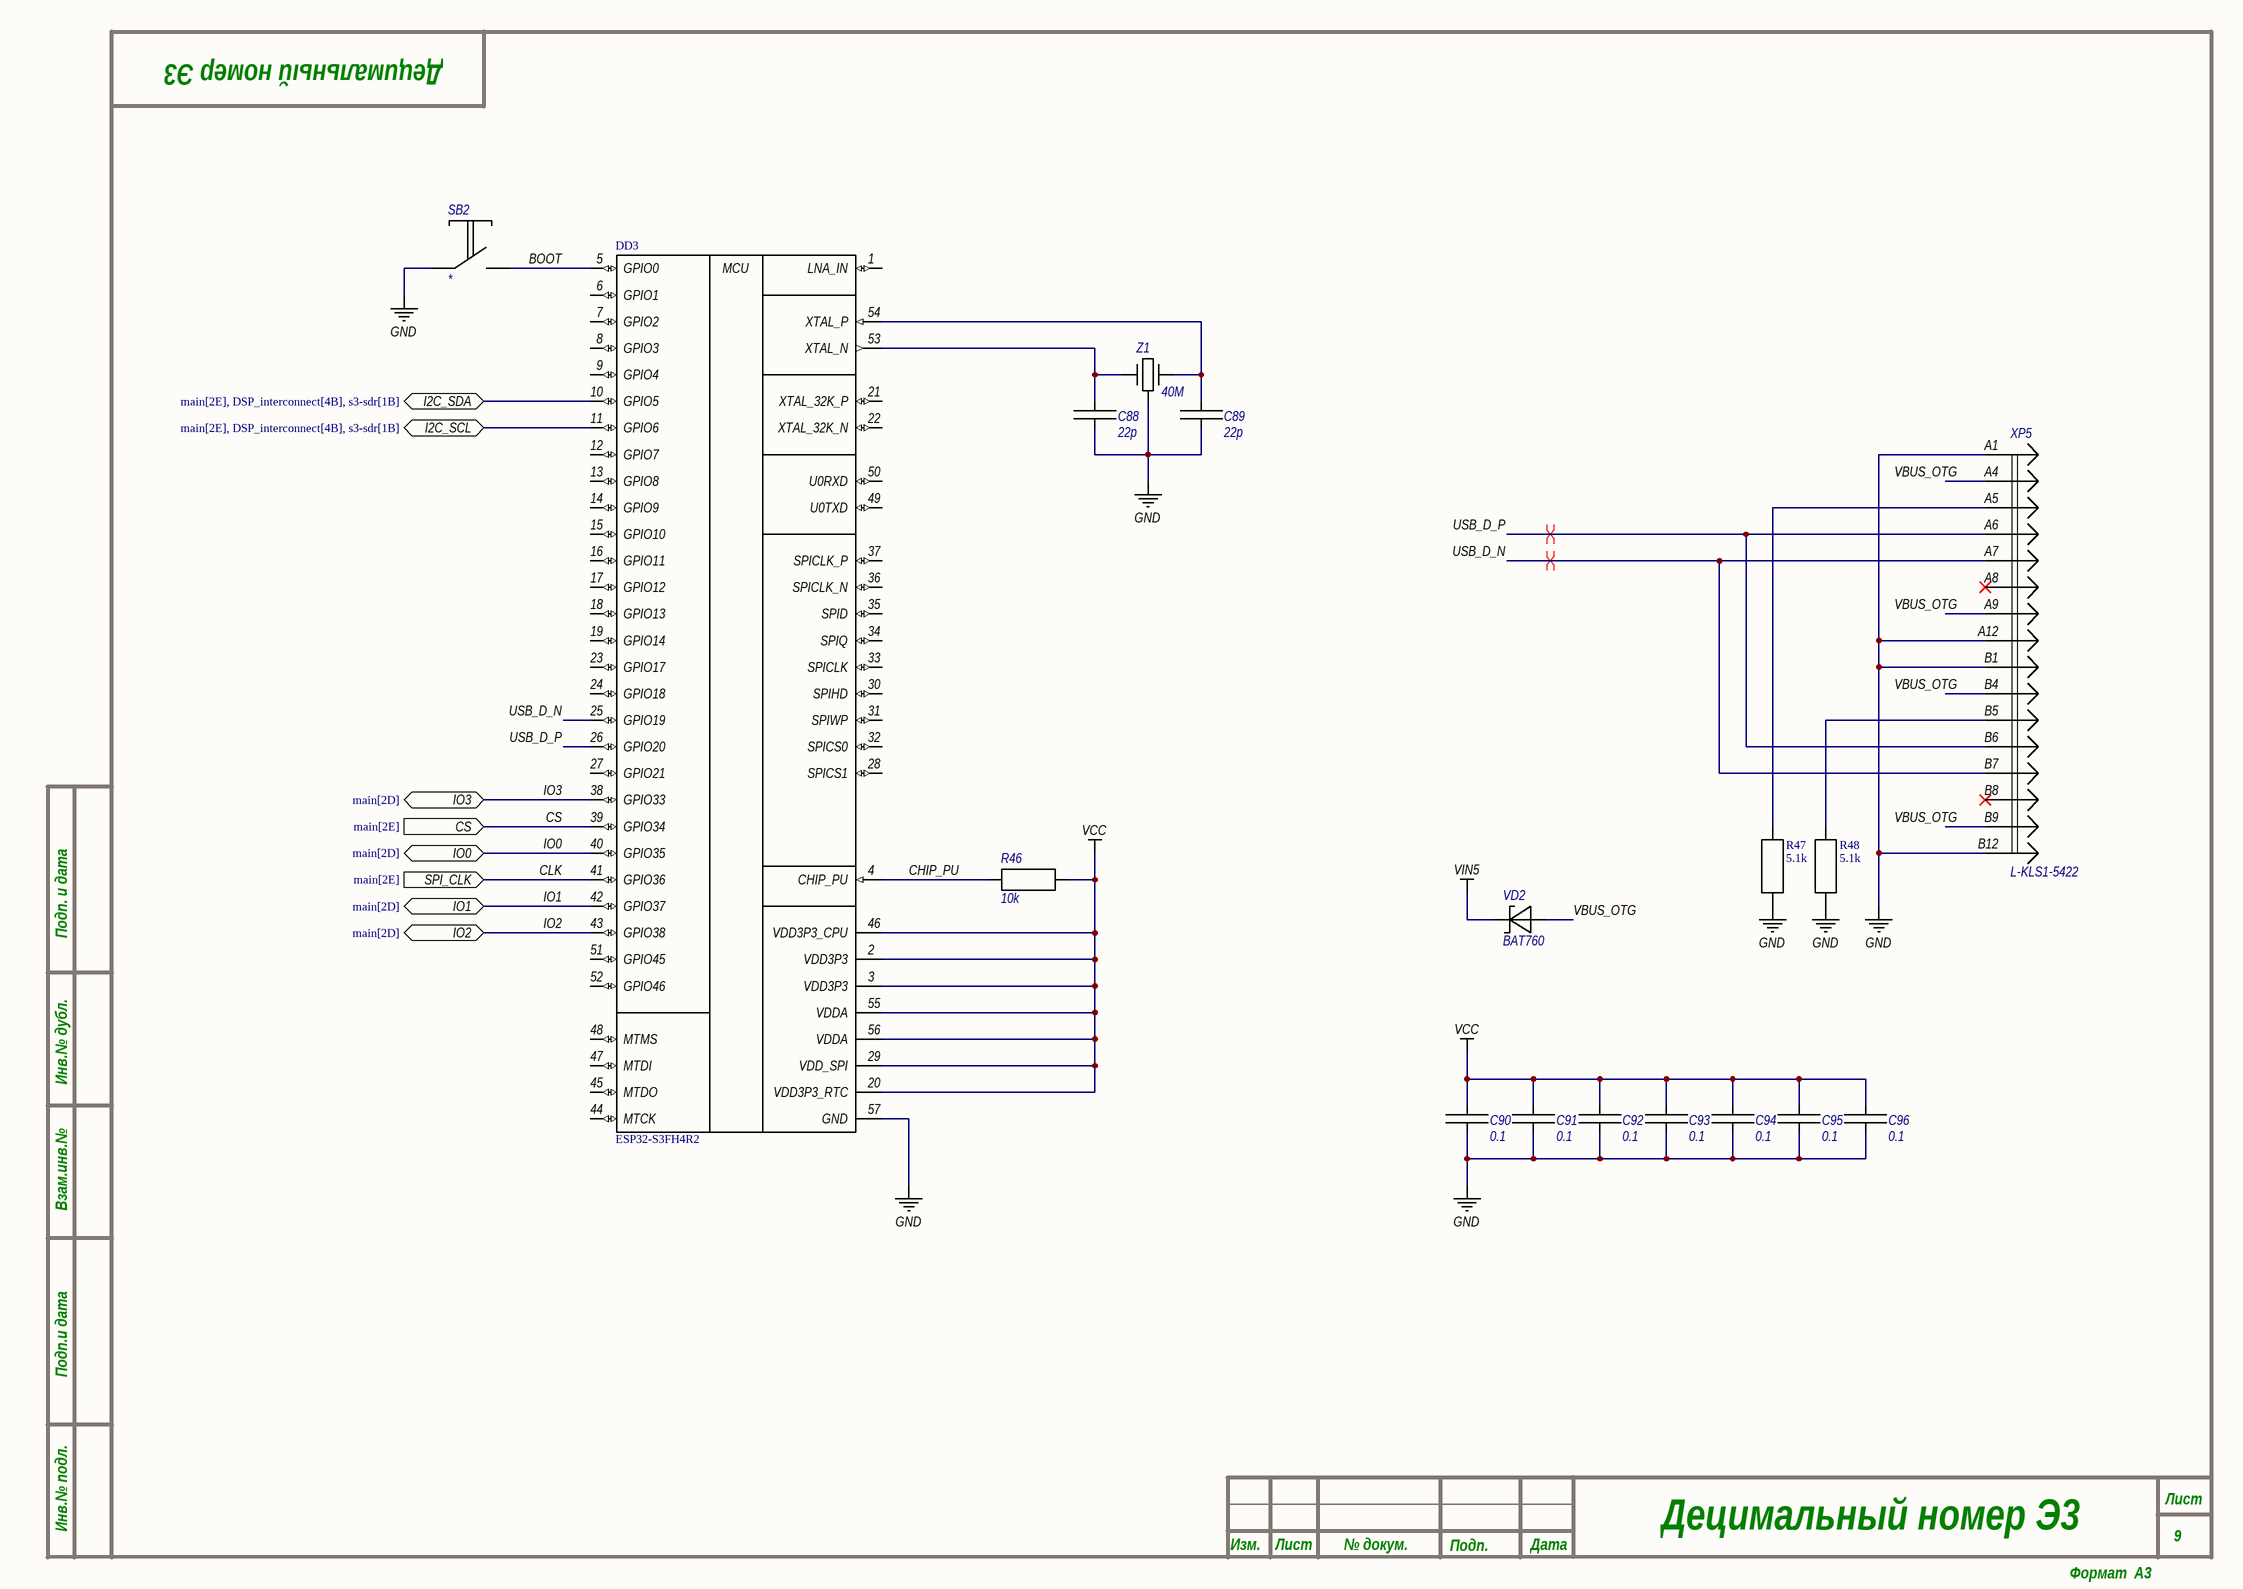
[diagram p8: s3_dsp.SchDoc]

### Parts
C88  22p  [C0603C]
C89  22p  [C0603C]
C90  0.1  [C0805C]
C91  0.1  [C0805C]
C92  0.1  [C0805C]
C93  0.1  [C0805C]
C94  0.1  [C0805C]
C95  0.1  [C0805C]
C96  0.1  [C0805C]
DD3  ESP32-S3FH4R2  [QFN56_7X7_EXP-M]
R46  10k  [C0805R]
R47  5.1k  [C0805R]
R48  5.1k  [C0805R]
SB2  *  [SW_B3U-1000P]
VD2  BAT760  [SOD123]
XP5  L-KLS1-5422  [L-KLS1-5422]
Z1  40M  [DFN170P250X90-4N]

### Ports
CS (in, see main[2E]), I2C_SCL (bidir, see main[2E], DSP_interconnect[4B], s3-sdr[1B]), I2C_SDA (bidir, see main[2E], DSP_interconnect[4B], s3-sdr[1B]), IO0 (bidir, see main[2D]), IO1 (bidir, see main[2D]), IO2 (bidir, see main[2D]), IO3 (bidir, see main[2D]), SPI_CLK (in, see main[2E])

### Nets
GND: C88.2 C89.2 C90.2 C91.2 C92.2 C93.2 C94.2 C95.2 C96.2 DD3.57(GND) R47.2 R48.2 SB2.1 XP5.A1 XP5.A12 XP5.B1 XP5.B12 Z1.2,4(E)
VCC: C90.1 C91.1 C92.1 C93.1 C94.1 C95.1 C96.1 DD3.2(VDD3P3) DD3.3(VDD3P3) DD3.20(VDD3P3_RTC) DD3.29(VDD_SPI) DD3.46(VDD3P3_CPU) DD3.55(VDDA) DD3.56(VDDA) R46.1
VIN5: VD2.C
BOOT: DD3.5(GPIO0) SB2.2  [project net BOOT_9]
CHIP_PU: DD3.4(CHIP_PU) R46.2  [project net CHIP_PU_9]
CLK: DD3.41(GPIO36) ; port SPI_CLK
CS: DD3.39(GPIO34) ; port CS
I2C_SCL: DD3.11(GPIO6) ; port I2C_SCL
I2C_SDA: DD3.10(GPIO5) ; port I2C_SDA
IO0: DD3.40(GPIO35) ; port IO0
IO1: DD3.42(GPIO37) ; port IO1
IO2: DD3.43(GPIO38) ; port IO2
IO3: DD3.38(GPIO33) ; port IO3
USB_D_N: DD3.25(GPIO19) XP5.A7 XP5.B7  [project net USB_D_N_9]
USB_D_P: DD3.26(GPIO20) XP5.A6 XP5.B6  [project net USB_D_P_9]
VBUS_OTG: VD2.A XP5.A4 XP5.A9 XP5.B4 XP5.B9  [project net VBUS_OTG_9]
NetC88_1: C88.1 DD3.53(XTAL_N) Z1.1(OSC1)
NetC89_1: C89.1 DD3.54(XTAL_P) Z1.3(OSC2)
NetR47_1: R47.1 XP5.A5
NetR48_1: R48.1 XP5.B5

Not connected (* = marked no-connect by the designer): DD3 1(LNA_IN) 6(GPIO1) 7(GPIO2) 8(GPIO3) 9(GPIO4) 12(GPIO7) 13(GPIO8) 14(GPIO9) 15(GPIO10) 16(GPIO11) 17(GPIO12) 18(GPIO13) 19(GPIO14) 21(XTAL_32K_P) 22(XTAL_32K_N) 23(GPIO17) 24(GPIO18) 27(GPIO21) 28(SPICS1) 30(SPIHD) 31(SPIWP) 32(SPICS0) 33(SPICLK) 34(SPIQ) 35(SPID) 36(SPICLK_N) 37(SPICLK_P) 44(MTCK) 45(MTDO) 47(MTDI) 48(MTMS) 49(U0TXD) 50(U0RXD) 51(GPIO45) 52(GPIO46); XP5 A8* B8*

### Layout directives
differential pair: USB_D_N_9, USB_D_P_9

### Notes on the sheet
- Подп. и дата
- Инв.№ дубл.
- Взам.инв.№
- Подп.и дата
- Инв.№ подл.
- Изм.
- Лист
- № докум.
- Подп.
- Дата
- Формат  A3
- (in symbol ESP32-S3) MCU

### Library data of the parts
C88-C96 = Cap
  C88 C89: Value: 22p
  C90-C96: Value: 0.1
DD3 = ESP32-S3: as DD1 on sheet s3-sdr; Copyright: Copyright (C) 2025 Ultra Librarian. All rights reserved.; Manufacturer_Part_Number: ESP32-S3; RefDes: RefDes; Type: Type
R46 = res: Value: 10k
R47 R48 = res: MAPPING: 2(1,2,100)(1,2,100); Value: 5.1k; TYPE: Resistor
SB2 = SW-PB: Part number: *
VD2 = Shotktky Diode: Part number: BAT760
XP5 = L-KLS1-5422: as XP1 on sheet s3-sdr; Part number: L-KLS1-5422
Z1 = XTALE: Value: 40M

## Nets that join several sheets
AVCC5: FE0 (T1A.2), FE1 (T1B.2), FE2 (T1C.2), FE3 (T1D.2), frontend_tx (T2.2)
GND: FE0 (29 pins), FE1 (29 pins), FE2 (29 pins), FE3 (29 pins), RX0 (18 pins), RX1 (18 pins), RX2 (18 pins), RX3 (18 pins), b2b_ant_plate (84 pins), clock (65 pins), RX (18 pins), frontend_tx (28 pins), power (8 pins), DSP_interconnect (11 pins), s3_dsp (18 pins)
VCC: FE0 (C11A.1 DA1A.1 DA1A.3), FE1 (C11B.1 DA1B.1 DA1B.3), FE2 (C11C.1 DA1C.1 DA1C.3), FE3 (C11D.1 DA1D.1 DA1D.3), RX0 (15 pins), RX1 (15 pins), RX2 (15 pins), RX3 (15 pins), clock (49 pins), RX (15 pins), power (6 pins), DSP_interconnect (7 pins), s3_dsp (15 pins)
VIN5: RX0 (VD1B.C), RX1 (VD1C.C), RX2 (VD1D.C), RX3 (VD1E.C), RX (VD1A.C), power (C84.1 C85.1 DA13.1 DA13.2), DSP_interconnect (XM1.30), s3_dsp (VD2.C)
VINHP: FE0 (C16A.1 DA4A.6), FE1 (C16B.1 DA4B.6), FE2 (C16C.1 DA4C.6), FE3 (C16D.1 DA4D.6), frontend_tx (C72.1 DA10.6), power (TP1.1)
ANTBIAS0: FE0 (DA1A.5), b2b_ant_plate (XP4.53 XP4.54 XP4.55)
ANTBIAS1: FE1 (DA1B.5), b2b_ant_plate (XP4.65 XP4.66 XP4.67)
ANTBIAS2: FE2 (DA1C.5), b2b_ant_plate (XP4.69 XP4.70 XP4.71)
ANTBIAS3: FE3 (DA1D.5), b2b_ant_plate (XP4.81 XP4.82 XP4.83)
CAL_SW_N: FE0 (DA5A.4), FE1 (DA5B.4), FE2 (DA5C.4), FE3 (DA5D.4), frontend_tx (DA12.4), DSP_interconnect (DD2.9)
CAL_SW_P: FE0 (DA5A.6), FE1 (DA5B.6), FE2 (DA5C.6), FE3 (DA5D.6), frontend_tx (DA12.6), DSP_interconnect (DD2.8)
CLK: RX0 (DD1B.41), DSP_interconnect (XM1.4)
CLK: RX1 (DD1C.41), DSP_interconnect (XM1.10)
CLK: RX2 (DD1D.41), DSP_interconnect (XM1.16)
CLK: RX3 (DD1E.41), DSP_interconnect (XM1.22)
CLK: RX (DD1A.41), DSP_interconnect (XM1.28)
CLK: DSP_interconnect (XM1.38), s3_dsp (DD3.41)
CLK_IN0: RX0 (C1B.2), clock (R28.1)
CLK_IN1: RX1 (C1C.2), clock (R29.1)
CLK_IN2: RX2 (C1D.2), clock (R31.1)
CLK_IN3: RX3 (C1E.2), clock (R32.1)
CLK_IN4: clock (R30.1), RX (C1A.2)
CS: DSP_interconnect (XM1.36), s3_dsp (DD3.39)
CS0: RX0 (DD1B.39), DSP_interconnect (XM1.2)
CS0: RX1 (DD1C.39), DSP_interconnect (XM1.8)
CS0: RX2 (DD1D.39), DSP_interconnect (XM1.14)
CS0: RX3 (DD1E.39), DSP_interconnect (XM1.20)
CS0: RX (DD1A.39), DSP_interconnect (XM1.26)
I2C_SCL: RX0 (DD1B.11), RX1 (DD1C.11), RX2 (DD1D.11), RX3 (DD1E.11), RX (DD1A.11), DSP_interconnect (DD2.31 R20.1 XM1.33), s3_dsp (DD3.11)
I2C_SDA: RX0 (DD1B.10), RX1 (DD1C.10), RX2 (DD1D.10), RX3 (DD1E.10), RX (DD1A.10), DSP_interconnect (DD2.30 R19.1 XM1.34), s3_dsp (DD3.10)
IF: FE0 (DA5A.5), RX0 (C3B.2 R3B.1)
IF: FE1 (DA5B.5), RX1 (C3C.2 R3C.1)
IF: FE2 (DA5C.5), RX2 (C3D.2 R3D.1)
IF: FE3 (DA5D.5), RX3 (C3E.2 R3E.1)
IF: RX (C3A.2 R3A.1), frontend_tx (DA12.5)
IO0: RX0 (DD1B.40), DSP_interconnect (XM1.3)
IO0: RX1 (DD1C.40), DSP_interconnect (XM1.9)
IO0: RX2 (DD1D.40), DSP_interconnect (XM1.15)
IO0: RX3 (DD1E.40), DSP_interconnect (XM1.21)
IO0: RX (DD1A.40), DSP_interconnect (XM1.27)
IO0: DSP_interconnect (XM1.37), s3_dsp (DD3.40)
IO1: RX0 (DD1B.42), DSP_interconnect (XM1.5)
IO1: RX1 (DD1C.42), DSP_interconnect (XM1.11)
IO1: RX2 (DD1D.42), DSP_interconnect (XM1.17)
IO1: RX3 (DD1E.42), DSP_interconnect (XM1.23)
IO1: RX (DD1A.42), DSP_interconnect (XM1.31)
IO1: DSP_interconnect (XM1.39), s3_dsp (DD3.42)
IO2: RX0 (DD1B.43), DSP_interconnect (XM1.6)
IO2: RX1 (DD1C.43), DSP_interconnect (XM1.12)
IO2: RX2 (DD1D.43), DSP_interconnect (XM1.18)
IO2: RX3 (DD1E.43), DSP_interconnect (XM1.24)
IO2: RX (DD1A.43), DSP_interconnect (XM1.32)
IO2: DSP_interconnect (XM1.40), s3_dsp (DD3.43)
IO3: RX0 (DD1B.38), DSP_interconnect (XM1.1)
IO3: RX1 (DD1C.38), DSP_interconnect (XM1.7)
IO3: RX2 (DD1D.38), DSP_interconnect (XM1.13)
IO3: RX3 (DD1E.38), DSP_interconnect (XM1.19)
IO3: RX (DD1A.38), DSP_interconnect (XM1.25)
IO3: DSP_interconnect (XM1.35), s3_dsp (DD3.38)
LMK_CLK: clock (DA8.19), DSP_interconnect (DD2.13)
LMK_CS: clock (DA8.18 R34.2), DSP_interconnect (DD2.14)
LMK_LD: clock (DA8.31), DSP_interconnect (DD2.18)
LMK_RESET: clock (DA8.5 R25.1), DSP_interconnect (DD2.16)
LMK_SD: clock (DA8.20), DSP_interconnect (DD2.15)
LMK_SYNC: clock (DA8.6 R26.1), DSP_interconnect (DD2.17)
LO0: main (R8.2), FE0 (C15A.1)
LO1: main (R9.2), FE1 (C15B.1)
LO2: main (R10.2), FE2 (C15C.1)
LO3: main (R11.2), FE3 (C15D.1)
MIXEN: FE0 (DA4A.4), FE1 (DA4B.4), FE2 (DA4C.4), FE3 (DA4D.4), frontend_tx (DA10.4), DSP_interconnect (DD2.12)
NetC66_2: main (R17.1), clock (C66.2)
NetC73_1: main (R12.2), frontend_tx (C73.1)
PHASE_CAL: main (R18.1), frontend_tx (R41.1 R42.1)
PHASE_SYNC0: main (R13.2), FE0 (DA5A.3)
PHASE_SYNC1: main (R14.2), FE1 (DA5B.3)
PHASE_SYNC2: main (R15.2), FE2 (DA5C.3)
PHASE_SYNC3: main (R16.2), FE3 (DA5D.3)
PL_SW_N: FE0 (DA2A.4), FE1 (DA2B.4), FE2 (DA2C.4), FE3 (DA2D.4), DSP_interconnect (DD2.11)
PL_SW_P: FE0 (DA2A.6), FE1 (DA2B.6), FE2 (DA2C.6), FE3 (DA2D.6), DSP_interconnect (DD2.10)
RF_IN0: FE0 (DA2A.1), b2b_ant_plate (XP4.4)
RF_IN1: FE1 (DA2B.1), b2b_ant_plate (XP4.16)
RF_IN2: FE2 (DA2C.1), b2b_ant_plate (XP4.20)
RF_IN3: FE3 (DA2D.1), b2b_ant_plate (XP4.32)
SYNTH_CE: clock (DA9.1), DSP_interconnect (DD2.29)
SYNTH_CLK: clock (DA9.16), DSP_interconnect (DD2.26)
SYNTH_CS: clock (DA9.24), DSP_interconnect (DD2.25)
SYNTH_MOSI: clock (DA9.17), DSP_interconnect (DD2.28)
SYNTH_MUXOUT: clock (DA9.20), DSP_interconnect (DD2.27)